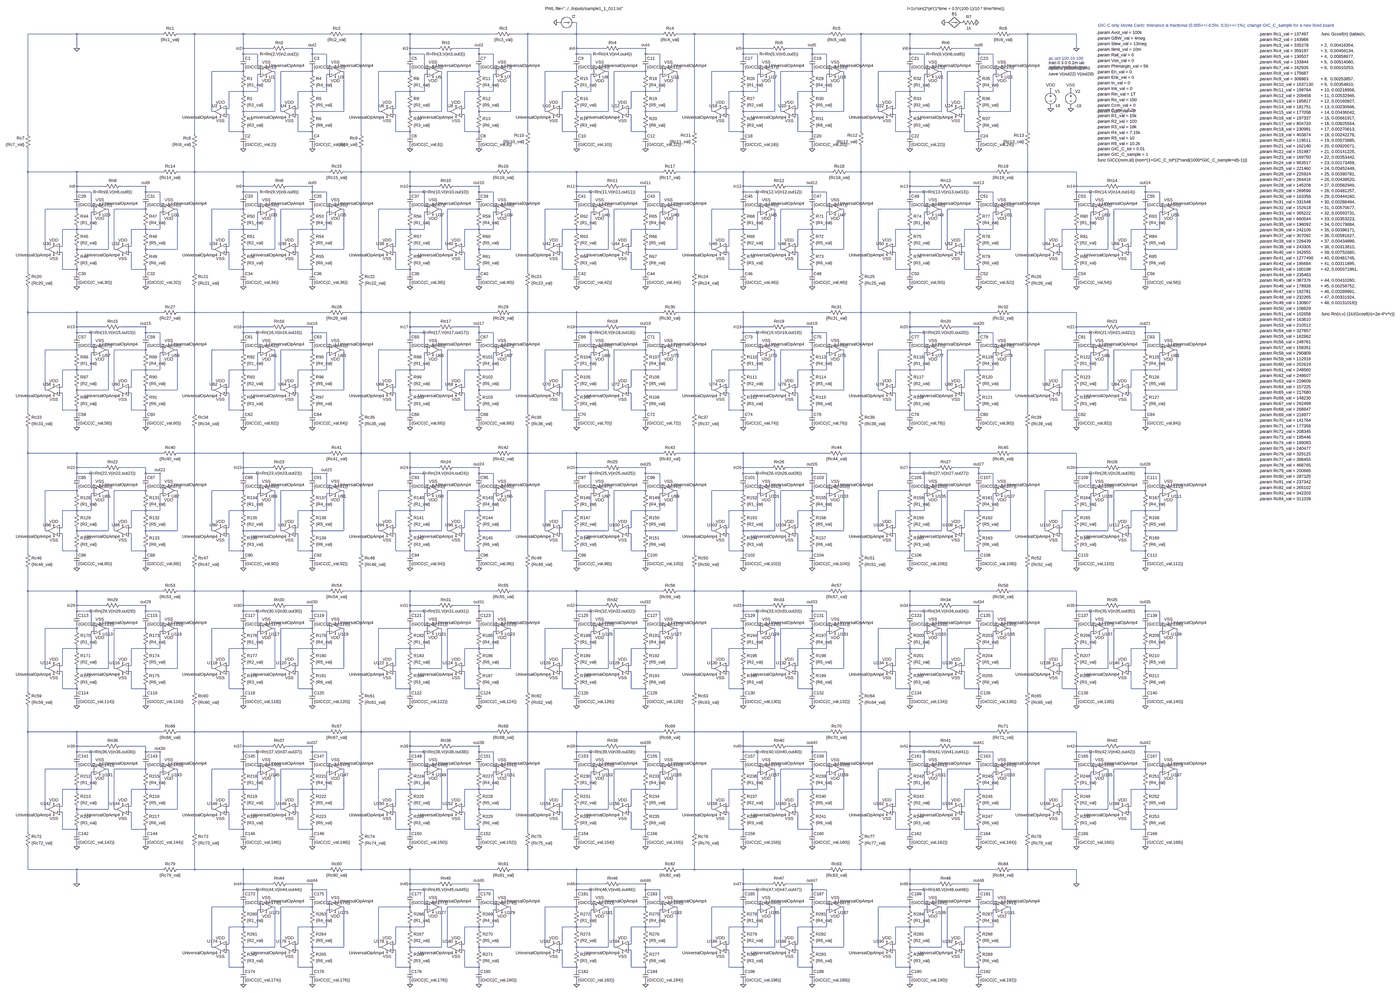
[diagram p0: schematic GIC_C.asc, whole sheet]
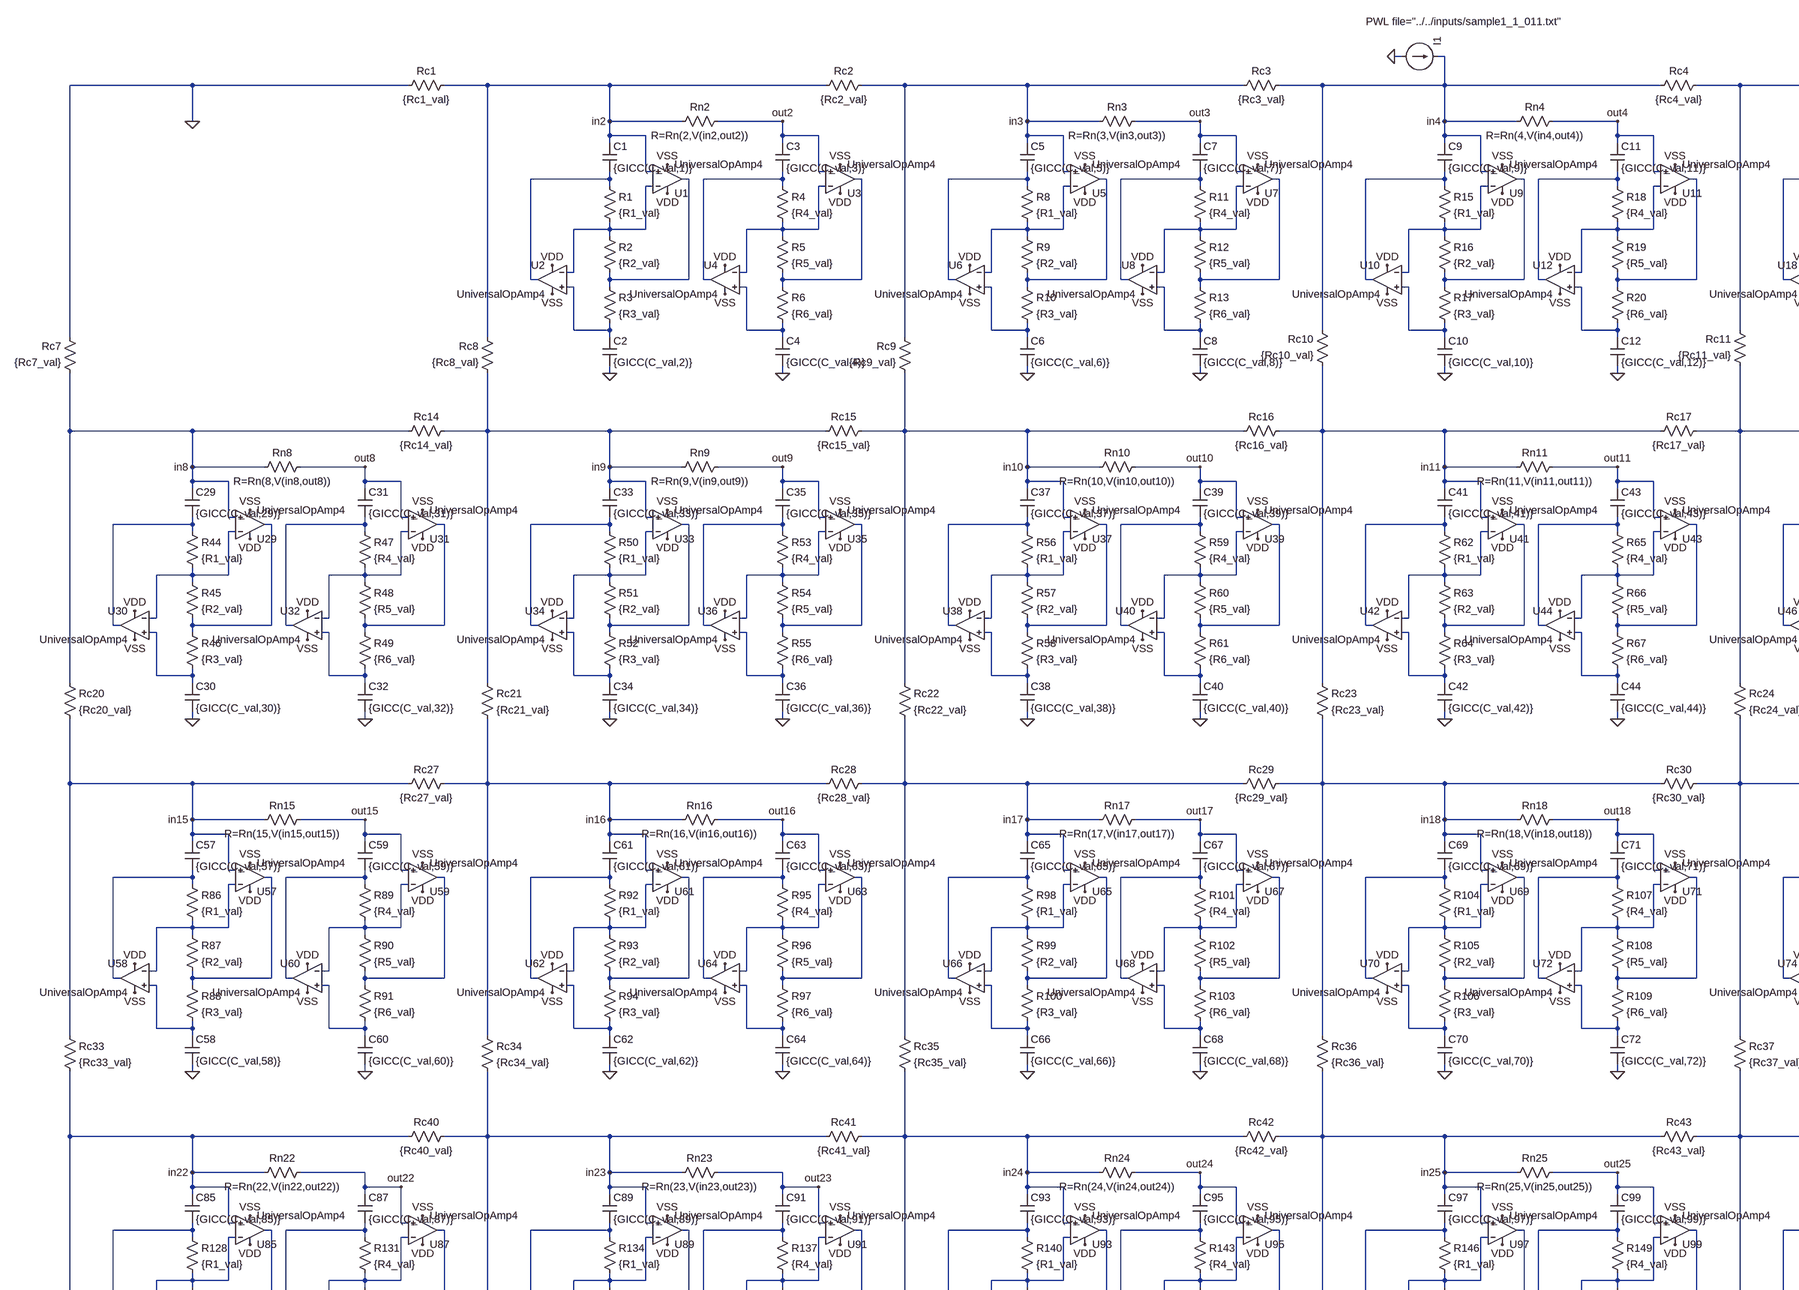
[diagram p1: schematic GIC_C.asc, part, row 1 of 2, column 1 of 2]
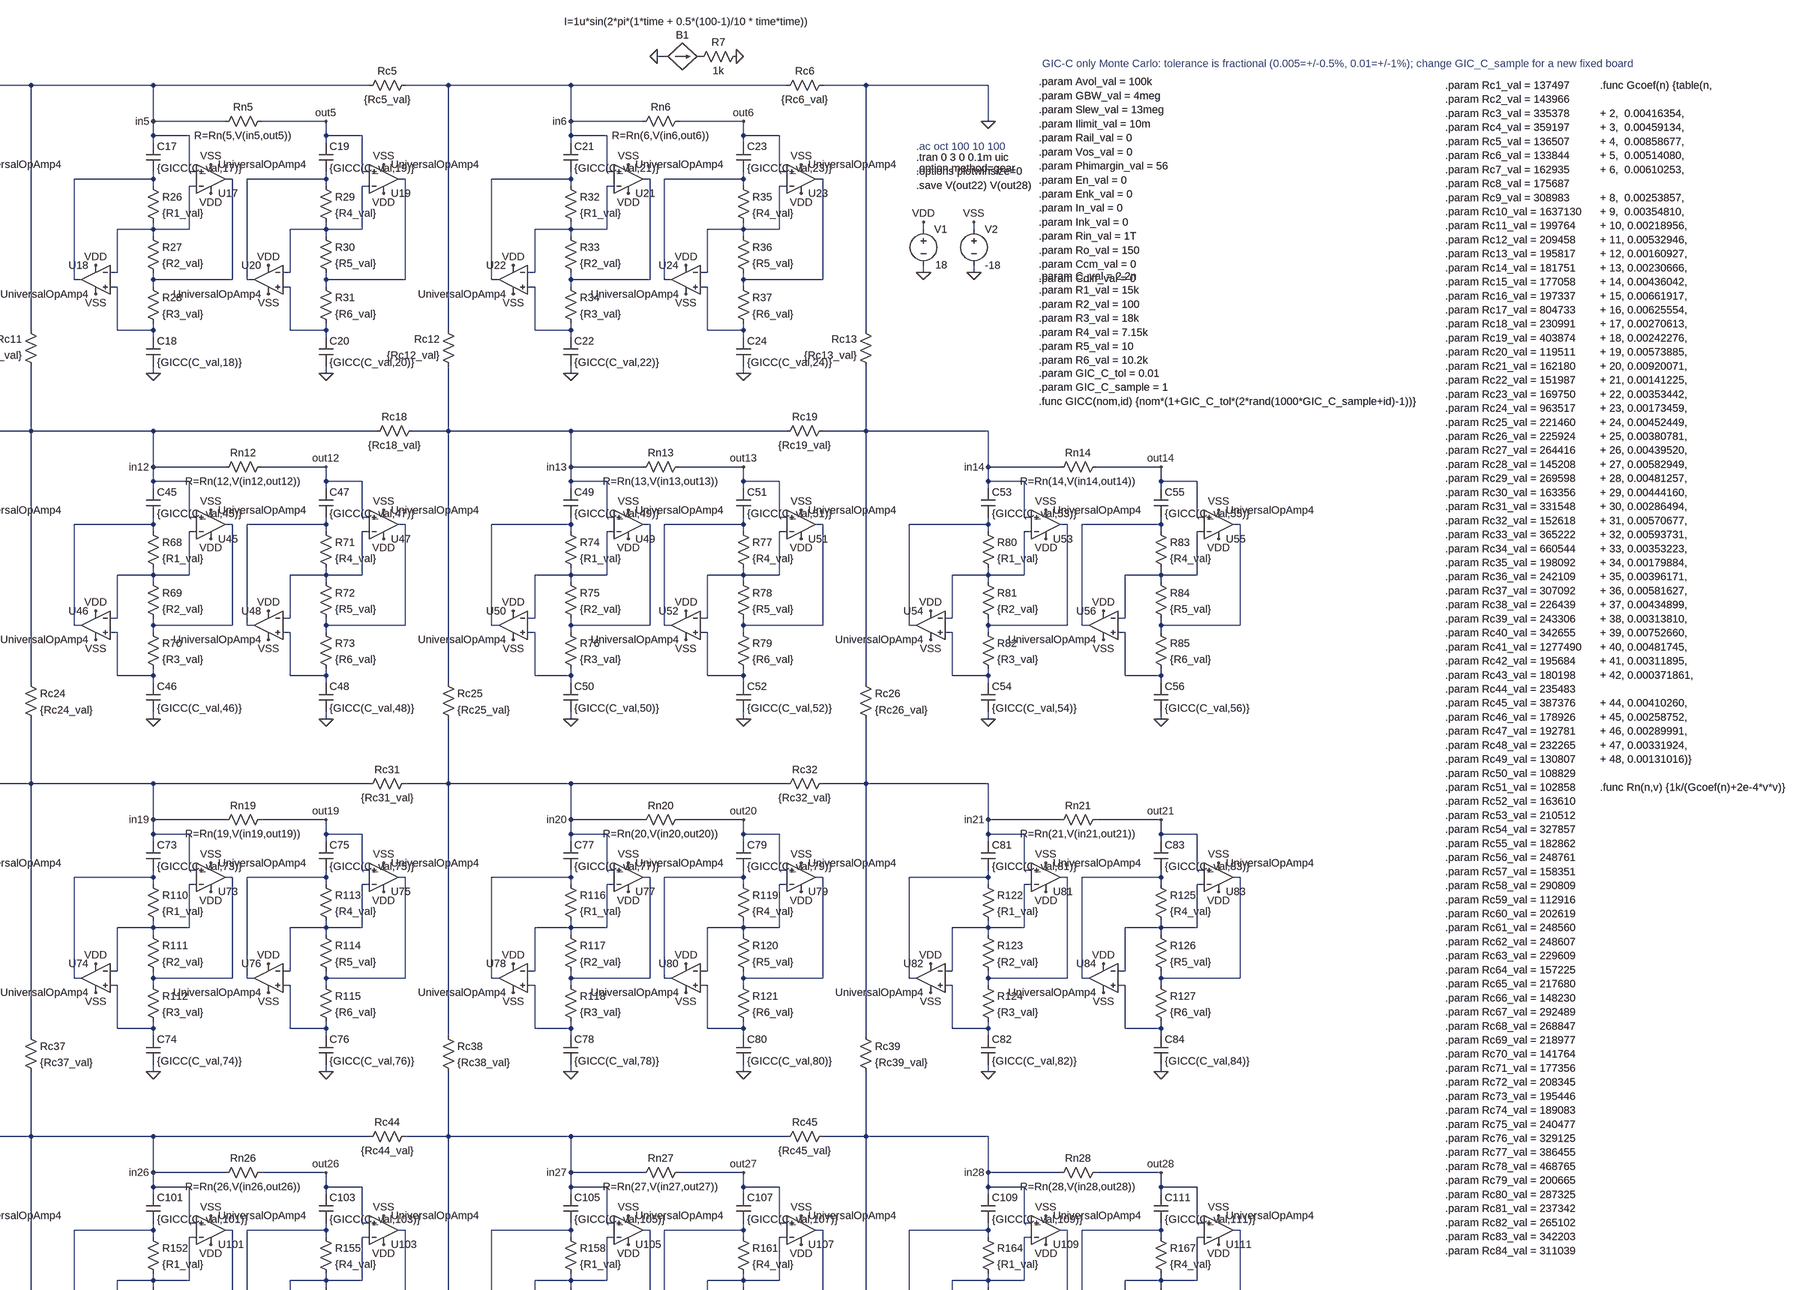
[diagram p2: schematic GIC_C.asc, part, row 1 of 2, column 2 of 2]
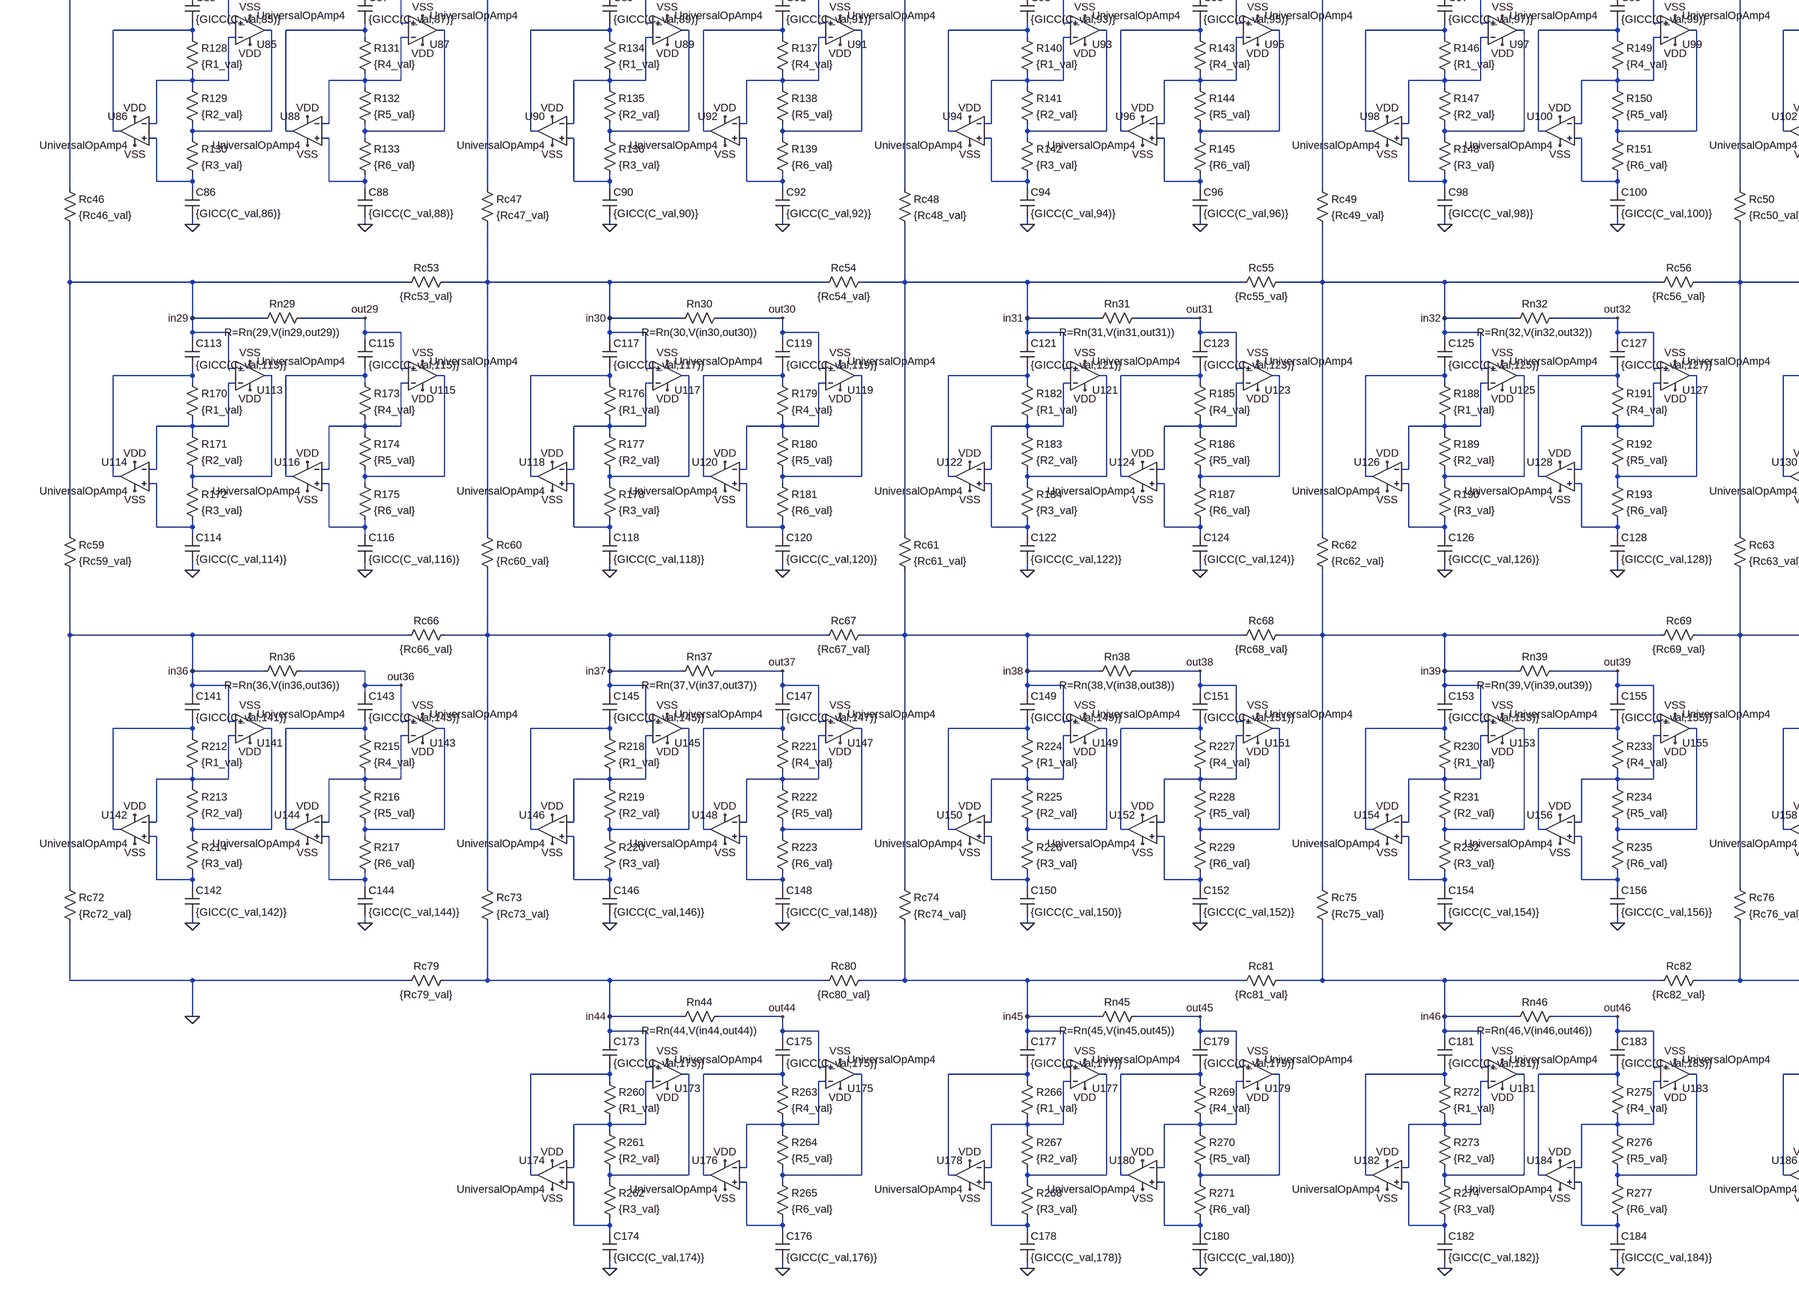
[diagram p3: schematic GIC_C.asc, part, row 2 of 2, column 1 of 2]
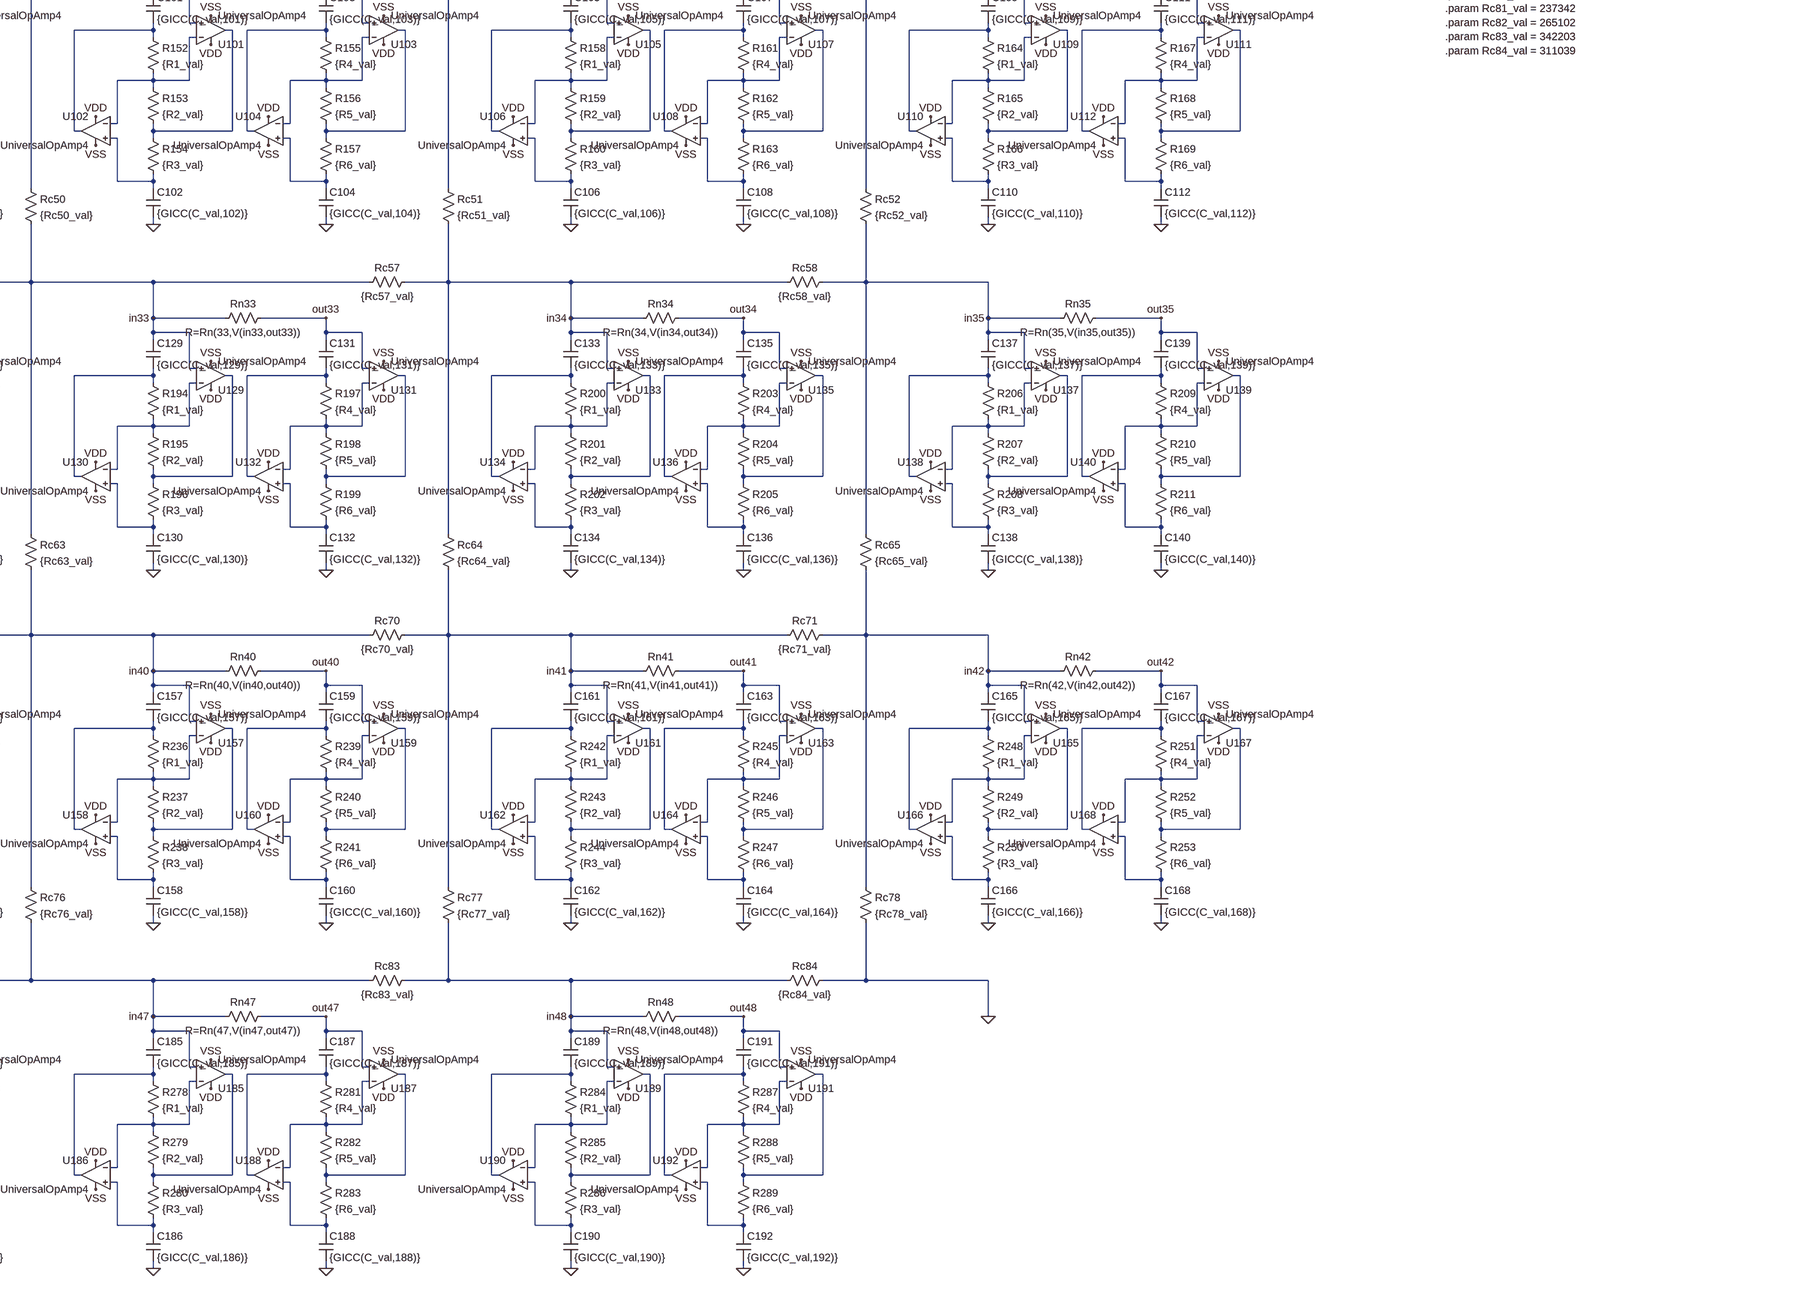
[diagram p4: schematic GIC_C.asc, part, row 2 of 2, column 2 of 2]
* GIC_C.asc
V1 VDD 0 18
V2 VSS 0 -18
C1 in2 N001 {GICC(C_val,1)}
R1 N001 N021 {R1_val}
R2 N021 N002 {R2_val}
R3 N002 N031 {R3_val}
C2 N031 0 {GICC(C_val,2)}
C3 out2 N003 {GICC(C_val,3)}
R4 N003 N022 {R4_val}
R5 N022 N004 {R5_val}
R6 N004 N032 {R6_val}
C4 N032 0 {GICC(C_val,4)}
Rn2 out2 in2 R=Rn(2,V(in2,out2))
C5 in3 N005 {GICC(C_val,5)}
R8 N005 N023 {R1_val}
R9 N023 N006 {R2_val}
R10 N006 N033 {R3_val}
C6 N033 0 {GICC(C_val,6)}
C7 out3 N007 {GICC(C_val,7)}
R11 N007 N024 {R4_val}
R12 N024 N008 {R5_val}
R13 N008 N034 {R6_val}
C8 N034 0 {GICC(C_val,8)}
Rn3 out3 in3 R=Rn(3,V(in3,out3))
C9 in4 N009 {GICC(C_val,9)}
R15 N009 N025 {R1_val}
R16 N025 N010 {R2_val}
R17 N010 N035 {R3_val}
C10 N035 0 {GICC(C_val,10)}
C11 out4 N011 {GICC(C_val,11)}
R18 N011 N026 {R4_val}
R19 N026 N012 {R5_val}
R20 N012 N036 {R6_val}
C12 N036 0 {GICC(C_val,12)}
Rn4 out4 in4 R=Rn(4,V(in4,out4))
Rc2 in3 in2 {Rc2_val}
Rc3 in4 in3 {Rc3_val}
Rc8 in9 in2 {Rc8_val}
Rc9 in10 in3 {Rc9_val}
Rc10 in11 in4 {Rc10_val}
Rc14 in8 in9 {Rc14_val}
Rc15 in9 in10 {Rc15_val}
Rc16 in10 in11 {Rc16_val}
Rc17 in11 in12 {Rc17_val}
Rc20 in8 in15 {Rc20_val}
Rc21 in9 in16 {Rc21_val}
Rc22 in10 in17 {Rc22_val}
Rc23 in11 in18 {Rc23_val}
Rc24 in12 in19 {Rc24_val}
Rc27 in16 in15 {Rc27_val}
Rc28 in17 in16 {Rc28_val}
Rc29 in18 in17 {Rc29_val}
Rc30 in19 in18 {Rc30_val}
Rc33 in15 in22 {Rc33_val}
Rc34 in16 in23 {Rc34_val}
Rc35 in17 in24 {Rc35_val}
Rc36 in18 in25 {Rc36_val}
Rc37 in19 in26 {Rc37_val}
Rc40 in23 in22 {Rc40_val}
Rc41 in24 in23 {Rc41_val}
Rc42 in25 in24 {Rc42_val}
Rc43 in26 in25 {Rc43_val}
Rc46 in22 in29 {Rc46_val}
Rc47 in23 in30 {Rc47_val}
Rc48 in24 in31 {Rc48_val}
Rc49 in25 in32 {Rc49_val}
Rc50 in26 in33 {Rc50_val}
Rc1 in2 0 {Rc1_val}
Rc7 in8 0 {Rc7_val}
Rc11 in12 in5 {Rc11_val}
Rc4 in4 in5 {Rc4_val}
Rc53 in30 in29 {Rc53_val}
Rc54 in31 in30 {Rc54_val}
Rc55 in32 in31 {Rc55_val}
Rc56 in33 in32 {Rc56_val}
R7 0 P001 1k
B1 0 P001 I=1u*sin(2*pi*(1*time + 0.5*(100-1)/10 * time*time))
I1 0 in4 PWL file="../../inputs/sample1_1_011.txt"
* U1: UniversalOpAmp4 Avol={Avol_val} GBW={GBW_val} Slew={Slew_val} Ilimit={Ilimit_val} Rail={Rail_val} Vos={Vos_val} Phimargin={Phimargin_val} En={En_val} Enk={Enk_val} In={In_val} Ink={Ink_val} Rin={Rin_val} Ro={Ro_val} Ccm={Ccm_val} Cdiff={Cdiff_val} (symbol OpAmps\UniversalOpAmp4 not available, pins judged from their places): In+=in2 In-=N021 V+=VDD V-=VSS OUT=N002
* U2: UniversalOpAmp4 Avol={Avol_val} GBW={GBW_val} Slew={Slew_val} Ilimit={Ilimit_val} Rail={Rail_val} Vos={Vos_val} Phimargin={Phimargin_val} En={En_val} Enk={Enk_val} In={In_val} Ink={Ink_val} Rin={Rin_val} Ro={Ro_val} Ccm={Ccm_val} Cdiff={Cdiff_val} (symbol OpAmps\UniversalOpAmp4 not available, pins judged from their places): In+=N031 In-=N021 V+=VDD V-=VSS OUT=N001
* U3: UniversalOpAmp4 Avol={Avol_val} GBW={GBW_val} Slew={Slew_val} Ilimit={Ilimit_val} Rail={Rail_val} Vos={Vos_val} Phimargin={Phimargin_val} En={En_val} Enk={Enk_val} In={In_val} Ink={Ink_val} Rin={Rin_val} Ro={Ro_val} Ccm={Ccm_val} Cdiff={Cdiff_val} (symbol OpAmps\UniversalOpAmp4 not available, pins judged from their places): In+=out2 In-=N022 V+=VDD V-=VSS OUT=N004
* U4: UniversalOpAmp4 Avol={Avol_val} GBW={GBW_val} Slew={Slew_val} Ilimit={Ilimit_val} Rail={Rail_val} Vos={Vos_val} Phimargin={Phimargin_val} En={En_val} Enk={Enk_val} In={In_val} Ink={Ink_val} Rin={Rin_val} Ro={Ro_val} Ccm={Ccm_val} Cdiff={Cdiff_val} (symbol OpAmps\UniversalOpAmp4 not available, pins judged from their places): In+=N032 In-=N022 V+=VDD V-=VSS OUT=N003
* U5: UniversalOpAmp4 Avol={Avol_val} GBW={GBW_val} Slew={Slew_val} Ilimit={Ilimit_val} Rail={Rail_val} Vos={Vos_val} Phimargin={Phimargin_val} En={En_val} Enk={Enk_val} In={In_val} Ink={Ink_val} Rin={Rin_val} Ro={Ro_val} Ccm={Ccm_val} Cdiff={Cdiff_val} (symbol OpAmps\UniversalOpAmp4 not available, pins judged from their places): In+=in3 In-=N023 V+=VDD V-=VSS OUT=N006
* U6: UniversalOpAmp4 Avol={Avol_val} GBW={GBW_val} Slew={Slew_val} Ilimit={Ilimit_val} Rail={Rail_val} Vos={Vos_val} Phimargin={Phimargin_val} En={En_val} Enk={Enk_val} In={In_val} Ink={Ink_val} Rin={Rin_val} Ro={Ro_val} Ccm={Ccm_val} Cdiff={Cdiff_val} (symbol OpAmps\UniversalOpAmp4 not available, pins judged from their places): In+=N033 In-=N023 V+=VDD V-=VSS OUT=N005
* U7: UniversalOpAmp4 Avol={Avol_val} GBW={GBW_val} Slew={Slew_val} Ilimit={Ilimit_val} Rail={Rail_val} Vos={Vos_val} Phimargin={Phimargin_val} En={En_val} Enk={Enk_val} In={In_val} Ink={Ink_val} Rin={Rin_val} Ro={Ro_val} Ccm={Ccm_val} Cdiff={Cdiff_val} (symbol OpAmps\UniversalOpAmp4 not available, pins judged from their places): In+=out3 In-=N024 V+=VDD V-=VSS OUT=N008
* U8: UniversalOpAmp4 Avol={Avol_val} GBW={GBW_val} Slew={Slew_val} Ilimit={Ilimit_val} Rail={Rail_val} Vos={Vos_val} Phimargin={Phimargin_val} En={En_val} Enk={Enk_val} In={In_val} Ink={Ink_val} Rin={Rin_val} Ro={Ro_val} Ccm={Ccm_val} Cdiff={Cdiff_val} (symbol OpAmps\UniversalOpAmp4 not available, pins judged from their places): In+=N034 In-=N024 V+=VDD V-=VSS OUT=N007
* U9: UniversalOpAmp4 Avol={Avol_val} GBW={GBW_val} Slew={Slew_val} Ilimit={Ilimit_val} Rail={Rail_val} Vos={Vos_val} Phimargin={Phimargin_val} En={En_val} Enk={Enk_val} In={In_val} Ink={Ink_val} Rin={Rin_val} Ro={Ro_val} Ccm={Ccm_val} Cdiff={Cdiff_val} (symbol OpAmps\UniversalOpAmp4 not available, pins judged from their places): In+=in4 In-=N025 V+=VDD V-=VSS OUT=N010
* U10: UniversalOpAmp4 Avol={Avol_val} GBW={GBW_val} Slew={Slew_val} Ilimit={Ilimit_val} Rail={Rail_val} Vos={Vos_val} Phimargin={Phimargin_val} En={En_val} Enk={Enk_val} In={In_val} Ink={Ink_val} Rin={Rin_val} Ro={Ro_val} Ccm={Ccm_val} Cdiff={Cdiff_val} (symbol OpAmps\UniversalOpAmp4 not available, pins judged from their places): In+=N035 In-=N025 V+=VDD V-=VSS OUT=N009
* U11: UniversalOpAmp4 Avol={Avol_val} GBW={GBW_val} Slew={Slew_val} Ilimit={Ilimit_val} Rail={Rail_val} Vos={Vos_val} Phimargin={Phimargin_val} En={En_val} Enk={Enk_val} In={In_val} Ink={Ink_val} Rin={Rin_val} Ro={Ro_val} Ccm={Ccm_val} Cdiff={Cdiff_val} (symbol OpAmps\UniversalOpAmp4 not available, pins judged from their places): In+=out4 In-=N026 V+=VDD V-=VSS OUT=N012
* U12: UniversalOpAmp4 Avol={Avol_val} GBW={GBW_val} Slew={Slew_val} Ilimit={Ilimit_val} Rail={Rail_val} Vos={Vos_val} Phimargin={Phimargin_val} En={En_val} Enk={Enk_val} In={In_val} Ink={Ink_val} Rin={Rin_val} Ro={Ro_val} Ccm={Ccm_val} Cdiff={Cdiff_val} (symbol OpAmps\UniversalOpAmp4 not available, pins judged from their places): In+=N036 In-=N026 V+=VDD V-=VSS OUT=N011
Rc12 in13 in6 {Rc12_val}
Rc19 in13 in14 {Rc19_val}
Rc25 in13 in20 {Rc25_val}
Rc26 in14 in21 {Rc26_val}
Rc32 in21 in20 {Rc32_val}
Rc38 in20 in27 {Rc38_val}
Rc39 in21 in28 {Rc39_val}
Rc45 in28 in27 {Rc45_val}
Rc51 in27 in34 {Rc51_val}
Rc52 in28 in35 {Rc52_val}
Rc13 in14 0 {Rc13_val}
Rc6 in6 0 {Rc6_val}
Rc58 in35 in34 {Rc58_val}
Rc5 in5 in6 {Rc5_val}
Rc18 in12 in13 {Rc18_val}
Rc31 in19 in20 {Rc31_val}
Rc44 in26 in27 {Rc44_val}
Rc57 in33 in34 {Rc57_val}
Rc59 in29 in36 {Rc59_val}
Rc60 in30 in37 {Rc60_val}
Rc61 in31 in38 {Rc61_val}
Rc62 in32 in39 {Rc62_val}
Rc63 in33 in40 {Rc63_val}
Rc66 in37 in36 {Rc66_val}
Rc67 in38 in37 {Rc67_val}
Rc68 in39 in38 {Rc68_val}
Rc69 in40 in39 {Rc69_val}
Rc72 in36 0 {Rc72_val}
Rc73 in37 in44 {Rc73_val}
Rc74 in38 in45 {Rc74_val}
Rc75 in39 in46 {Rc75_val}
Rc76 in40 in47 {Rc76_val}
Rc79 in44 0 {Rc79_val}
Rc80 in45 in44 {Rc80_val}
Rc81 in46 in45 {Rc81_val}
Rc82 in47 in46 {Rc82_val}
Rc64 in34 in41 {Rc64_val}
Rc65 in35 in42 {Rc65_val}
Rc71 in42 in41 {Rc71_val}
Rc77 in41 in48 {Rc77_val}
Rc78 in42 0 {Rc78_val}
Rc84 0 in48 {Rc84_val}
Rc70 in40 in41 {Rc70_val}
Rc83 in47 in48 {Rc83_val}
C17 in5 N013 {GICC(C_val,17)}
R26 N013 N027 {R1_val}
R27 N027 N014 {R2_val}
R28 N014 N037 {R3_val}
C18 N037 0 {GICC(C_val,18)}
C19 out5 N015 {GICC(C_val,19)}
R29 N015 N028 {R4_val}
R30 N028 N016 {R5_val}
R31 N016 N038 {R6_val}
C20 N038 0 {GICC(C_val,20)}
Rn5 out5 in5 R=Rn(5,V(in5,out5))
* U17: UniversalOpAmp4 Avol={Avol_val} GBW={GBW_val} Slew={Slew_val} Ilimit={Ilimit_val} Rail={Rail_val} Vos={Vos_val} Phimargin={Phimargin_val} En={En_val} Enk={Enk_val} In={In_val} Ink={Ink_val} Rin={Rin_val} Ro={Ro_val} Ccm={Ccm_val} Cdiff={Cdiff_val} (symbol OpAmps\UniversalOpAmp4 not available, pins judged from their places): In+=in5 In-=N027 V+=VDD V-=VSS OUT=N014
* U18: UniversalOpAmp4 Avol={Avol_val} GBW={GBW_val} Slew={Slew_val} Ilimit={Ilimit_val} Rail={Rail_val} Vos={Vos_val} Phimargin={Phimargin_val} En={En_val} Enk={Enk_val} In={In_val} Ink={Ink_val} Rin={Rin_val} Ro={Ro_val} Ccm={Ccm_val} Cdiff={Cdiff_val} (symbol OpAmps\UniversalOpAmp4 not available, pins judged from their places): In+=N037 In-=N027 V+=VDD V-=VSS OUT=N013
* U19: UniversalOpAmp4 Avol={Avol_val} GBW={GBW_val} Slew={Slew_val} Ilimit={Ilimit_val} Rail={Rail_val} Vos={Vos_val} Phimargin={Phimargin_val} En={En_val} Enk={Enk_val} In={In_val} Ink={Ink_val} Rin={Rin_val} Ro={Ro_val} Ccm={Ccm_val} Cdiff={Cdiff_val} (symbol OpAmps\UniversalOpAmp4 not available, pins judged from their places): In+=out5 In-=N028 V+=VDD V-=VSS OUT=N016
* U20: UniversalOpAmp4 Avol={Avol_val} GBW={GBW_val} Slew={Slew_val} Ilimit={Ilimit_val} Rail={Rail_val} Vos={Vos_val} Phimargin={Phimargin_val} En={En_val} Enk={Enk_val} In={In_val} Ink={Ink_val} Rin={Rin_val} Ro={Ro_val} Ccm={Ccm_val} Cdiff={Cdiff_val} (symbol OpAmps\UniversalOpAmp4 not available, pins judged from their places): In+=N038 In-=N028 V+=VDD V-=VSS OUT=N015
C21 in6 N017 {GICC(C_val,21)}
R32 N017 N029 {R1_val}
R33 N029 N018 {R2_val}
R34 N018 N039 {R3_val}
C22 N039 0 {GICC(C_val,22)}
C23 out6 N019 {GICC(C_val,23)}
R35 N019 N030 {R4_val}
R36 N030 N020 {R5_val}
R37 N020 N040 {R6_val}
C24 N040 0 {GICC(C_val,24)}
Rn6 out6 in6 R=Rn(6,V(in6,out6))
* U21: UniversalOpAmp4 Avol={Avol_val} GBW={GBW_val} Slew={Slew_val} Ilimit={Ilimit_val} Rail={Rail_val} Vos={Vos_val} Phimargin={Phimargin_val} En={En_val} Enk={Enk_val} In={In_val} Ink={Ink_val} Rin={Rin_val} Ro={Ro_val} Ccm={Ccm_val} Cdiff={Cdiff_val} (symbol OpAmps\UniversalOpAmp4 not available, pins judged from their places): In+=in6 In-=N029 V+=VDD V-=VSS OUT=N018
* U22: UniversalOpAmp4 Avol={Avol_val} GBW={GBW_val} Slew={Slew_val} Ilimit={Ilimit_val} Rail={Rail_val} Vos={Vos_val} Phimargin={Phimargin_val} En={En_val} Enk={Enk_val} In={In_val} Ink={Ink_val} Rin={Rin_val} Ro={Ro_val} Ccm={Ccm_val} Cdiff={Cdiff_val} (symbol OpAmps\UniversalOpAmp4 not available, pins judged from their places): In+=N039 In-=N029 V+=VDD V-=VSS OUT=N017
* U23: UniversalOpAmp4 Avol={Avol_val} GBW={GBW_val} Slew={Slew_val} Ilimit={Ilimit_val} Rail={Rail_val} Vos={Vos_val} Phimargin={Phimargin_val} En={En_val} Enk={Enk_val} In={In_val} Ink={Ink_val} Rin={Rin_val} Ro={Ro_val} Ccm={Ccm_val} Cdiff={Cdiff_val} (symbol OpAmps\UniversalOpAmp4 not available, pins judged from their places): In+=out6 In-=N030 V+=VDD V-=VSS OUT=N020
* U24: UniversalOpAmp4 Avol={Avol_val} GBW={GBW_val} Slew={Slew_val} Ilimit={Ilimit_val} Rail={Rail_val} Vos={Vos_val} Phimargin={Phimargin_val} En={En_val} Enk={Enk_val} In={In_val} Ink={Ink_val} Rin={Rin_val} Ro={Ro_val} Ccm={Ccm_val} Cdiff={Cdiff_val} (symbol OpAmps\UniversalOpAmp4 not available, pins judged from their places): In+=N040 In-=N030 V+=VDD V-=VSS OUT=N019
C29 in8 N041 {GICC(C_val,29)}
R44 N041 N069 {R1_val}
R45 N069 N042 {R2_val}
R46 N042 N083 {R3_val}
C30 N083 0 {GICC(C_val,30)}
C31 out8 N043 {GICC(C_val,31)}
R47 N043 N070 {R4_val}
R48 N070 N044 {R5_val}
R49 N044 N084 {R6_val}
C32 N084 0 {GICC(C_val,32)}
Rn8 out8 in8 R=Rn(8,V(in8,out8))
* U29: UniversalOpAmp4 Avol={Avol_val} GBW={GBW_val} Slew={Slew_val} Ilimit={Ilimit_val} Rail={Rail_val} Vos={Vos_val} Phimargin={Phimargin_val} En={En_val} Enk={Enk_val} In={In_val} Ink={Ink_val} Rin={Rin_val} Ro={Ro_val} Ccm={Ccm_val} Cdiff={Cdiff_val} (symbol OpAmps\UniversalOpAmp4 not available, pins judged from their places): In+=in8 In-=N069 V+=VDD V-=VSS OUT=N042
* U30: UniversalOpAmp4 Avol={Avol_val} GBW={GBW_val} Slew={Slew_val} Ilimit={Ilimit_val} Rail={Rail_val} Vos={Vos_val} Phimargin={Phimargin_val} En={En_val} Enk={Enk_val} In={In_val} Ink={Ink_val} Rin={Rin_val} Ro={Ro_val} Ccm={Ccm_val} Cdiff={Cdiff_val} (symbol OpAmps\UniversalOpAmp4 not available, pins judged from their places): In+=N083 In-=N069 V+=VDD V-=VSS OUT=N041
* U31: UniversalOpAmp4 Avol={Avol_val} GBW={GBW_val} Slew={Slew_val} Ilimit={Ilimit_val} Rail={Rail_val} Vos={Vos_val} Phimargin={Phimargin_val} En={En_val} Enk={Enk_val} In={In_val} Ink={Ink_val} Rin={Rin_val} Ro={Ro_val} Ccm={Ccm_val} Cdiff={Cdiff_val} (symbol OpAmps\UniversalOpAmp4 not available, pins judged from their places): In+=out8 In-=N070 V+=VDD V-=VSS OUT=N044
* U32: UniversalOpAmp4 Avol={Avol_val} GBW={GBW_val} Slew={Slew_val} Ilimit={Ilimit_val} Rail={Rail_val} Vos={Vos_val} Phimargin={Phimargin_val} En={En_val} Enk={Enk_val} In={In_val} Ink={Ink_val} Rin={Rin_val} Ro={Ro_val} Ccm={Ccm_val} Cdiff={Cdiff_val} (symbol OpAmps\UniversalOpAmp4 not available, pins judged from their places): In+=N084 In-=N070 V+=VDD V-=VSS OUT=N043
C33 in9 N045 {GICC(C_val,33)}
R50 N045 N071 {R1_val}
R51 N071 N046 {R2_val}
R52 N046 N085 {R3_val}
C34 N085 0 {GICC(C_val,34)}
C35 out9 N047 {GICC(C_val,35)}
R53 N047 N072 {R4_val}
R54 N072 N048 {R5_val}
R55 N048 N086 {R6_val}
C36 N086 0 {GICC(C_val,36)}
Rn9 out9 in9 R=Rn(9,V(in9,out9))
* U33: UniversalOpAmp4 Avol={Avol_val} GBW={GBW_val} Slew={Slew_val} Ilimit={Ilimit_val} Rail={Rail_val} Vos={Vos_val} Phimargin={Phimargin_val} En={En_val} Enk={Enk_val} In={In_val} Ink={Ink_val} Rin={Rin_val} Ro={Ro_val} Ccm={Ccm_val} Cdiff={Cdiff_val} (symbol OpAmps\UniversalOpAmp4 not available, pins judged from their places): In+=in9 In-=N071 V+=VDD V-=VSS OUT=N046
* U34: UniversalOpAmp4 Avol={Avol_val} GBW={GBW_val} Slew={Slew_val} Ilimit={Ilimit_val} Rail={Rail_val} Vos={Vos_val} Phimargin={Phimargin_val} En={En_val} Enk={Enk_val} In={In_val} Ink={Ink_val} Rin={Rin_val} Ro={Ro_val} Ccm={Ccm_val} Cdiff={Cdiff_val} (symbol OpAmps\UniversalOpAmp4 not available, pins judged from their places): In+=N085 In-=N071 V+=VDD V-=VSS OUT=N045
* U35: UniversalOpAmp4 Avol={Avol_val} GBW={GBW_val} Slew={Slew_val} Ilimit={Ilimit_val} Rail={Rail_val} Vos={Vos_val} Phimargin={Phimargin_val} En={En_val} Enk={Enk_val} In={In_val} Ink={Ink_val} Rin={Rin_val} Ro={Ro_val} Ccm={Ccm_val} Cdiff={Cdiff_val} (symbol OpAmps\UniversalOpAmp4 not available, pins judged from their places): In+=out9 In-=N072 V+=VDD V-=VSS OUT=N048
* U36: UniversalOpAmp4 Avol={Avol_val} GBW={GBW_val} Slew={Slew_val} Ilimit={Ilimit_val} Rail={Rail_val} Vos={Vos_val} Phimargin={Phimargin_val} En={En_val} Enk={Enk_val} In={In_val} Ink={Ink_val} Rin={Rin_val} Ro={Ro_val} Ccm={Ccm_val} Cdiff={Cdiff_val} (symbol OpAmps\UniversalOpAmp4 not available, pins judged from their places): In+=N086 In-=N072 V+=VDD V-=VSS OUT=N047
C37 in10 N049 {GICC(C_val,37)}
R56 N049 N073 {R1_val}
R57 N073 N050 {R2_val}
R58 N050 N087 {R3_val}
C38 N087 0 {GICC(C_val,38)}
C39 out10 N051 {GICC(C_val,39)}
R59 N051 N074 {R4_val}
R60 N074 N052 {R5_val}
R61 N052 N088 {R6_val}
C40 N088 0 {GICC(C_val,40)}
Rn10 out10 in10 R=Rn(10,V(in10,out10))
* U37: UniversalOpAmp4 Avol={Avol_val} GBW={GBW_val} Slew={Slew_val} Ilimit={Ilimit_val} Rail={Rail_val} Vos={Vos_val} Phimargin={Phimargin_val} En={En_val} Enk={Enk_val} In={In_val} Ink={Ink_val} Rin={Rin_val} Ro={Ro_val} Ccm={Ccm_val} Cdiff={Cdiff_val} (symbol OpAmps\UniversalOpAmp4 not available, pins judged from their places): In+=in10 In-=N073 V+=VDD V-=VSS OUT=N050
* U38: UniversalOpAmp4 Avol={Avol_val} GBW={GBW_val} Slew={Slew_val} Ilimit={Ilimit_val} Rail={Rail_val} Vos={Vos_val} Phimargin={Phimargin_val} En={En_val} Enk={Enk_val} In={In_val} Ink={Ink_val} Rin={Rin_val} Ro={Ro_val} Ccm={Ccm_val} Cdiff={Cdiff_val} (symbol OpAmps\UniversalOpAmp4 not available, pins judged from their places): In+=N087 In-=N073 V+=VDD V-=VSS OUT=N049
* U39: UniversalOpAmp4 Avol={Avol_val} GBW={GBW_val} Slew={Slew_val} Ilimit={Ilimit_val} Rail={Rail_val} Vos={Vos_val} Phimargin={Phimargin_val} En={En_val} Enk={Enk_val} In={In_val} Ink={Ink_val} Rin={Rin_val} Ro={Ro_val} Ccm={Ccm_val} Cdiff={Cdiff_val} (symbol OpAmps\UniversalOpAmp4 not available, pins judged from their places): In+=out10 In-=N074 V+=VDD V-=VSS OUT=N052
* U40: UniversalOpAmp4 Avol={Avol_val} GBW={GBW_val} Slew={Slew_val} Ilimit={Ilimit_val} Rail={Rail_val} Vos={Vos_val} Phimargin={Phimargin_val} En={En_val} Enk={Enk_val} In={In_val} Ink={Ink_val} Rin={Rin_val} Ro={Ro_val} Ccm={Ccm_val} Cdiff={Cdiff_val} (symbol OpAmps\UniversalOpAmp4 not available, pins judged from their places): In+=N088 In-=N074 V+=VDD V-=VSS OUT=N051
C41 in11 N053 {GICC(C_val,41)}
R62 N053 N075 {R1_val}
R63 N075 N054 {R2_val}
R64 N054 N089 {R3_val}
C42 N089 0 {GICC(C_val,42)}
C43 out11 N055 {GICC(C_val,43)}
R65 N055 N076 {R4_val}
R66 N076 N056 {R5_val}
R67 N056 N090 {R6_val}
C44 N090 0 {GICC(C_val,44)}
Rn11 out11 in11 R=Rn(11,V(in11,out11))
* U41: UniversalOpAmp4 Avol={Avol_val} GBW={GBW_val} Slew={Slew_val} Ilimit={Ilimit_val} Rail={Rail_val} Vos={Vos_val} Phimargin={Phimargin_val} En={En_val} Enk={Enk_val} In={In_val} Ink={Ink_val} Rin={Rin_val} Ro={Ro_val} Ccm={Ccm_val} Cdiff={Cdiff_val} (symbol OpAmps\UniversalOpAmp4 not available, pins judged from their places): In+=in11 In-=N075 V+=VDD V-=VSS OUT=N054
* U42: UniversalOpAmp4 Avol={Avol_val} GBW={GBW_val} Slew={Slew_val} Ilimit={Ilimit_val} Rail={Rail_val} Vos={Vos_val} Phimargin={Phimargin_val} En={En_val} Enk={Enk_val} In={In_val} Ink={Ink_val} Rin={Rin_val} Ro={Ro_val} Ccm={Ccm_val} Cdiff={Cdiff_val} (symbol OpAmps\UniversalOpAmp4 not available, pins judged from their places): In+=N089 In-=N075 V+=VDD V-=VSS OUT=N053
* U43: UniversalOpAmp4 Avol={Avol_val} GBW={GBW_val} Slew={Slew_val} Ilimit={Ilimit_val} Rail={Rail_val} Vos={Vos_val} Phimargin={Phimargin_val} En={En_val} Enk={Enk_val} In={In_val} Ink={Ink_val} Rin={Rin_val} Ro={Ro_val} Ccm={Ccm_val} Cdiff={Cdiff_val} (symbol OpAmps\UniversalOpAmp4 not available, pins judged from their places): In+=out11 In-=N076 V+=VDD V-=VSS OUT=N056
* U44: UniversalOpAmp4 Avol={Avol_val} GBW={GBW_val} Slew={Slew_val} Ilimit={Ilimit_val} Rail={Rail_val} Vos={Vos_val} Phimargin={Phimargin_val} En={En_val} Enk={Enk_val} In={In_val} Ink={Ink_val} Rin={Rin_val} Ro={Ro_val} Ccm={Ccm_val} Cdiff={Cdiff_val} (symbol OpAmps\UniversalOpAmp4 not available, pins judged from their places): In+=N090 In-=N076 V+=VDD V-=VSS OUT=N055
C45 in12 N057 {GICC(C_val,45)}
R68 N057 N077 {R1_val}
R69 N077 N058 {R2_val}
R70 N058 N091 {R3_val}
C46 N091 0 {GICC(C_val,46)}
C47 out12 N059 {GICC(C_val,47)}
R71 N059 N078 {R4_val}
R72 N078 N060 {R5_val}
R73 N060 N092 {R6_val}
C48 N092 0 {GICC(C_val,48)}
Rn12 out12 in12 R=Rn(12,V(in12,out12))
* U45: UniversalOpAmp4 Avol={Avol_val} GBW={GBW_val} Slew={Slew_val} Ilimit={Ilimit_val} Rail={Rail_val} Vos={Vos_val} Phimargin={Phimargin_val} En={En_val} Enk={Enk_val} In={In_val} Ink={Ink_val} Rin={Rin_val} Ro={Ro_val} Ccm={Ccm_val} Cdiff={Cdiff_val} (symbol OpAmps\UniversalOpAmp4 not available, pins judged from their places): In+=in12 In-=N077 V+=VDD V-=VSS OUT=N058
* U46: UniversalOpAmp4 Avol={Avol_val} GBW={GBW_val} Slew={Slew_val} Ilimit={Ilimit_val} Rail={Rail_val} Vos={Vos_val} Phimargin={Phimargin_val} En={En_val} Enk={Enk_val} In={In_val} Ink={Ink_val} Rin={Rin_val} Ro={Ro_val} Ccm={Ccm_val} Cdiff={Cdiff_val} (symbol OpAmps\UniversalOpAmp4 not available, pins judged from their places): In+=N091 In-=N077 V+=VDD V-=VSS OUT=N057
* U47: UniversalOpAmp4 Avol={Avol_val} GBW={GBW_val} Slew={Slew_val} Ilimit={Ilimit_val} Rail={Rail_val} Vos={Vos_val} Phimargin={Phimargin_val} En={En_val} Enk={Enk_val} In={In_val} Ink={Ink_val} Rin={Rin_val} Ro={Ro_val} Ccm={Ccm_val} Cdiff={Cdiff_val} (symbol OpAmps\UniversalOpAmp4 not available, pins judged from their places): In+=out12 In-=N078 V+=VDD V-=VSS OUT=N060
* U48: UniversalOpAmp4 Avol={Avol_val} GBW={GBW_val} Slew={Slew_val} Ilimit={Ilimit_val} Rail={Rail_val} Vos={Vos_val} Phimargin={Phimargin_val} En={En_val} Enk={Enk_val} In={In_val} Ink={Ink_val} Rin={Rin_val} Ro={Ro_val} Ccm={Ccm_val} Cdiff={Cdiff_val} (symbol OpAmps\UniversalOpAmp4 not available, pins judged from their places): In+=N092 In-=N078 V+=VDD V-=VSS OUT=N059
C49 in13 N061 {GICC(C_val,49)}
R74 N061 N079 {R1_val}
R75 N079 N062 {R2_val}
R76 N062 N093 {R3_val}
C50 N093 0 {GICC(C_val,50)}
C51 out13 N063 {GICC(C_val,51)}
R77 N063 N080 {R4_val}
R78 N080 N064 {R5_val}
R79 N064 N094 {R6_val}
C52 N094 0 {GICC(C_val,52)}
Rn13 out13 in13 R=Rn(13,V(in13,out13))
* U49: UniversalOpAmp4 Avol={Avol_val} GBW={GBW_val} Slew={Slew_val} Ilimit={Ilimit_val} Rail={Rail_val} Vos={Vos_val} Phimargin={Phimargin_val} En={En_val} Enk={Enk_val} In={In_val} Ink={Ink_val} Rin={Rin_val} Ro={Ro_val} Ccm={Ccm_val} Cdiff={Cdiff_val} (symbol OpAmps\UniversalOpAmp4 not available, pins judged from their places): In+=in13 In-=N079 V+=VDD V-=VSS OUT=N062
* U50: UniversalOpAmp4 Avol={Avol_val} GBW={GBW_val} Slew={Slew_val} Ilimit={Ilimit_val} Rail={Rail_val} Vos={Vos_val} Phimargin={Phimargin_val} En={En_val} Enk={Enk_val} In={In_val} Ink={Ink_val} Rin={Rin_val} Ro={Ro_val} Ccm={Ccm_val} Cdiff={Cdiff_val} (symbol OpAmps\UniversalOpAmp4 not available, pins judged from their places): In+=N093 In-=N079 V+=VDD V-=VSS OUT=N061
* U51: UniversalOpAmp4 Avol={Avol_val} GBW={GBW_val} Slew={Slew_val} Ilimit={Ilimit_val} Rail={Rail_val} Vos={Vos_val} Phimargin={Phimargin_val} En={En_val} Enk={Enk_val} In={In_val} Ink={Ink_val} Rin={Rin_val} Ro={Ro_val} Ccm={Ccm_val} Cdiff={Cdiff_val} (symbol OpAmps\UniversalOpAmp4 not available, pins judged from their places): In+=out13 In-=N080 V+=VDD V-=VSS OUT=N064
* U52: UniversalOpAmp4 Avol={Avol_val} GBW={GBW_val} Slew={Slew_val} Ilimit={Ilimit_val} Rail={Rail_val} Vos={Vos_val} Phimargin={Phimargin_val} En={En_val} Enk={Enk_val} In={In_val} Ink={Ink_val} Rin={Rin_val} Ro={Ro_val} Ccm={Ccm_val} Cdiff={Cdiff_val} (symbol OpAmps\UniversalOpAmp4 not available, pins judged from their places): In+=N094 In-=N080 V+=VDD V-=VSS OUT=N063
C53 in14 N065 {GICC(C_val,53)}
R80 N065 N081 {R1_val}
R81 N081 N066 {R2_val}
R82 N066 N095 {R3_val}
C54 N095 0 {GICC(C_val,54)}
C55 out14 N067 {GICC(C_val,55)}
R83 N067 N082 {R4_val}
R84 N082 N068 {R5_val}
R85 N068 N096 {R6_val}
C56 N096 0 {GICC(C_val,56)}
Rn14 out14 in14 R=Rn(14,V(in14,out14))
* U53: UniversalOpAmp4 Avol={Avol_val} GBW={GBW_val} Slew={Slew_val} Ilimit={Ilimit_val} Rail={Rail_val} Vos={Vos_val} Phimargin={Phimargin_val} En={En_val} Enk={Enk_val} In={In_val} Ink={Ink_val} Rin={Rin_val} Ro={Ro_val} Ccm={Ccm_val} Cdiff={Cdiff_val} (symbol OpAmps\UniversalOpAmp4 not available, pins judged from their places): In+=in14 In-=N081 V+=VDD V-=VSS OUT=N066
* U54: UniversalOpAmp4 Avol={Avol_val} GBW={GBW_val} Slew={Slew_val} Ilimit={Ilimit_val} Rail={Rail_val} Vos={Vos_val} Phimargin={Phimargin_val} En={En_val} Enk={Enk_val} In={In_val} Ink={Ink_val} Rin={Rin_val} Ro={Ro_val} Ccm={Ccm_val} Cdiff={Cdiff_val} (symbol OpAmps\UniversalOpAmp4 not available, pins judged from their places): In+=N095 In-=N081 V+=VDD V-=VSS OUT=N065
* U55: UniversalOpAmp4 Avol={Avol_val} GBW={GBW_val} Slew={Slew_val} Ilimit={Ilimit_val} Rail={Rail_val} Vos={Vos_val} Phimargin={Phimargin_val} En={En_val} Enk={Enk_val} In={In_val} Ink={Ink_val} Rin={Rin_val} Ro={Ro_val} Ccm={Ccm_val} Cdiff={Cdiff_val} (symbol OpAmps\UniversalOpAmp4 not available, pins judged from their places): In+=out14 In-=N082 V+=VDD V-=VSS OUT=N068
* U56: UniversalOpAmp4 Avol={Avol_val} GBW={GBW_val} Slew={Slew_val} Ilimit={Ilimit_val} Rail={Rail_val} Vos={Vos_val} Phimargin={Phimargin_val} En={En_val} Enk={Enk_val} In={In_val} Ink={Ink_val} Rin={Rin_val} Ro={Ro_val} Ccm={Ccm_val} Cdiff={Cdiff_val} (symbol OpAmps\UniversalOpAmp4 not available, pins judged from their places): In+=N096 In-=N082 V+=VDD V-=VSS OUT=N067
C57 in15 N097 {GICC(C_val,57)}
R86 N097 N125 {R1_val}
R87 N125 N098 {R2_val}
R88 N098 N139 {R3_val}
C58 N139 0 {GICC(C_val,58)}
C59 out15 N099 {GICC(C_val,59)}
R89 N099 N126 {R4_val}
R90 N126 N100 {R5_val}
R91 N100 N140 {R6_val}
C60 N140 0 {GICC(C_val,60)}
Rn15 out15 in15 R=Rn(15,V(in15,out15))
* U57: UniversalOpAmp4 Avol={Avol_val} GBW={GBW_val} Slew={Slew_val} Ilimit={Ilimit_val} Rail={Rail_val} Vos={Vos_val} Phimargin={Phimargin_val} En={En_val} Enk={Enk_val} In={In_val} Ink={Ink_val} Rin={Rin_val} Ro={Ro_val} Ccm={Ccm_val} Cdiff={Cdiff_val} (symbol OpAmps\UniversalOpAmp4 not available, pins judged from their places): In+=in15 In-=N125 V+=VDD V-=VSS OUT=N098
* U58: UniversalOpAmp4 Avol={Avol_val} GBW={GBW_val} Slew={Slew_val} Ilimit={Ilimit_val} Rail={Rail_val} Vos={Vos_val} Phimargin={Phimargin_val} En={En_val} Enk={Enk_val} In={In_val} Ink={Ink_val} Rin={Rin_val} Ro={Ro_val} Ccm={Ccm_val} Cdiff={Cdiff_val} (symbol OpAmps\UniversalOpAmp4 not available, pins judged from their places): In+=N139 In-=N125 V+=VDD V-=VSS OUT=N097
* U59: UniversalOpAmp4 Avol={Avol_val} GBW={GBW_val} Slew={Slew_val} Ilimit={Ilimit_val} Rail={Rail_val} Vos={Vos_val} Phimargin={Phimargin_val} En={En_val} Enk={Enk_val} In={In_val} Ink={Ink_val} Rin={Rin_val} Ro={Ro_val} Ccm={Ccm_val} Cdiff={Cdiff_val} (symbol OpAmps\UniversalOpAmp4 not available, pins judged from their places): In+=out15 In-=N126 V+=VDD V-=VSS OUT=N100
* U60: UniversalOpAmp4 Avol={Avol_val} GBW={GBW_val} Slew={Slew_val} Ilimit={Ilimit_val} Rail={Rail_val} Vos={Vos_val} Phimargin={Phimargin_val} En={En_val} Enk={Enk_val} In={In_val} Ink={Ink_val} Rin={Rin_val} Ro={Ro_val} Ccm={Ccm_val} Cdiff={Cdiff_val} (symbol OpAmps\UniversalOpAmp4 not available, pins judged from their places): In+=N140 In-=N126 V+=VDD V-=VSS OUT=N099
C61 in16 N101 {GICC(C_val,61)}
R92 N101 N127 {R1_val}
R93 N127 N102 {R2_val}
R94 N102 N141 {R3_val}
C62 N141 0 {GICC(C_val,62)}
C63 out16 N103 {GICC(C_val,63)}
R95 N103 N128 {R4_val}
R96 N128 N104 {R5_val}
R97 N104 N142 {R6_val}
C64 N142 0 {GICC(C_val,64)}
Rn16 out16 in16 R=Rn(16,V(in16,out16))
* U61: UniversalOpAmp4 Avol={Avol_val} GBW={GBW_val} Slew={Slew_val} Ilimit={Ilimit_val} Rail={Rail_val} Vos={Vos_val} Phimargin={Phimargin_val} En={En_val} Enk={Enk_val} In={In_val} Ink={Ink_val} Rin={Rin_val} Ro={Ro_val} Ccm={Ccm_val} Cdiff={Cdiff_val} (symbol OpAmps\UniversalOpAmp4 not available, pins judged from their places): In+=in16 In-=N127 V+=VDD V-=VSS OUT=N102
* U62: UniversalOpAmp4 Avol={Avol_val} GBW={GBW_val} Slew={Slew_val} Ilimit={Ilimit_val} Rail={Rail_val} Vos={Vos_val} Phimargin={Phimargin_val} En={En_val} Enk={Enk_val} In={In_val} Ink={Ink_val} Rin={Rin_val} Ro={Ro_val} Ccm={Ccm_val} Cdiff={Cdiff_val} (symbol OpAmps\UniversalOpAmp4 not available, pins judged from their places): In+=N141 In-=N127 V+=VDD V-=VSS OUT=N101
* U63: UniversalOpAmp4 Avol={Avol_val} GBW={GBW_val} Slew={Slew_val} Ilimit={Ilimit_val} Rail={Rail_val} Vos={Vos_val} Phimargin={Phimargin_val} En={En_val} Enk={Enk_val} In={In_val} Ink={Ink_val} Rin={Rin_val} Ro={Ro_val} Ccm={Ccm_val} Cdiff={Cdiff_val} (symbol OpAmps\UniversalOpAmp4 not available, pins judged from their places): In+=out16 In-=N128 V+=VDD V-=VSS OUT=N104
* U64: UniversalOpAmp4 Avol={Avol_val} GBW={GBW_val} Slew={Slew_val} Ilimit={Ilimit_val} Rail={Rail_val} Vos={Vos_val} Phimargin={Phimargin_val} En={En_val} Enk={Enk_val} In={In_val} Ink={Ink_val} Rin={Rin_val} Ro={Ro_val} Ccm={Ccm_val} Cdiff={Cdiff_val} (symbol OpAmps\UniversalOpAmp4 not available, pins judged from their places): In+=N142 In-=N128 V+=VDD V-=VSS OUT=N103
C65 in17 N105 {GICC(C_val,65)}
R98 N105 N129 {R1_val}
R99 N129 N106 {R2_val}
R100 N106 N143 {R3_val}
C66 N143 0 {GICC(C_val,66)}
C67 out17 N107 {GICC(C_val,67)}
R101 N107 N130 {R4_val}
R102 N130 N108 {R5_val}
R103 N108 N144 {R6_val}
C68 N144 0 {GICC(C_val,68)}
Rn17 out17 in17 R=Rn(17,V(in17,out17))
* U65: UniversalOpAmp4 Avol={Avol_val} GBW={GBW_val} Slew={Slew_val} Ilimit={Ilimit_val} Rail={Rail_val} Vos={Vos_val} Phimargin={Phimargin_val} En={En_val} Enk={Enk_val} In={In_val} Ink={Ink_val} Rin={Rin_val} Ro={Ro_val} Ccm={Ccm_val} Cdiff={Cdiff_val} (symbol OpAmps\UniversalOpAmp4 not available, pins judged from their places): In+=in17 In-=N129 V+=VDD V-=VSS OUT=N106
* U66: UniversalOpAmp4 Avol={Avol_val} GBW={GBW_val} Slew={Slew_val} Ilimit={Ilimit_val} Rail={Rail_val} Vos={Vos_val} Phimargin={Phimargin_val} En={En_val} Enk={Enk_val} In={In_val} Ink={Ink_val} Rin={Rin_val} Ro={Ro_val} Ccm={Ccm_val} Cdiff={Cdiff_val} (symbol OpAmps\UniversalOpAmp4 not available, pins judged from their places): In+=N143 In-=N129 V+=VDD V-=VSS OUT=N105
* U67: UniversalOpAmp4 Avol={Avol_val} GBW={GBW_val} Slew={Slew_val} Ilimit={Ilimit_val} Rail={Rail_val} Vos={Vos_val} Phimargin={Phimargin_val} En={En_val} Enk={Enk_val} In={In_val} Ink={Ink_val} Rin={Rin_val} Ro={Ro_val} Ccm={Ccm_val} Cdiff={Cdiff_val} (symbol OpAmps\UniversalOpAmp4 not available, pins judged from their places): In+=out17 In-=N130 V+=VDD V-=VSS OUT=N108
* U68: UniversalOpAmp4 Avol={Avol_val} GBW={GBW_val} Slew={Slew_val} Ilimit={Ilimit_val} Rail={Rail_val} Vos={Vos_val} Phimargin={Phimargin_val} En={En_val} Enk={Enk_val} In={In_val} Ink={Ink_val} Rin={Rin_val} Ro={Ro_val} Ccm={Ccm_val} Cdiff={Cdiff_val} (symbol OpAmps\UniversalOpAmp4 not available, pins judged from their places): In+=N144 In-=N130 V+=VDD V-=VSS OUT=N107
C69 in18 N109 {GICC(C_val,69)}
R104 N109 N131 {R1_val}
R105 N131 N110 {R2_val}
R106 N110 N145 {R3_val}
C70 N145 0 {GICC(C_val,70)}
C71 out18 N111 {GICC(C_val,71)}
R107 N111 N132 {R4_val}
R108 N132 N112 {R5_val}
R109 N112 N146 {R6_val}
C72 N146 0 {GICC(C_val,72)}
Rn18 out18 in18 R=Rn(18,V(in18,out18))
* U69: UniversalOpAmp4 Avol={Avol_val} GBW={GBW_val} Slew={Slew_val} Ilimit={Ilimit_val} Rail={Rail_val} Vos={Vos_val} Phimargin={Phimargin_val} En={En_val} Enk={Enk_val} In={In_val} Ink={Ink_val} Rin={Rin_val} Ro={Ro_val} Ccm={Ccm_val} Cdiff={Cdiff_val} (symbol OpAmps\UniversalOpAmp4 not available, pins judged from their places): In+=in18 In-=N131 V+=VDD V-=VSS OUT=N110
* U70: UniversalOpAmp4 Avol={Avol_val} GBW={GBW_val} Slew={Slew_val} Ilimit={Ilimit_val} Rail={Rail_val} Vos={Vos_val} Phimargin={Phimargin_val} En={En_val} Enk={Enk_val} In={In_val} Ink={Ink_val} Rin={Rin_val} Ro={Ro_val} Ccm={Ccm_val} Cdiff={Cdiff_val} (symbol OpAmps\UniversalOpAmp4 not available, pins judged from their places): In+=N145 In-=N131 V+=VDD V-=VSS OUT=N109
* U71: UniversalOpAmp4 Avol={Avol_val} GBW={GBW_val} Slew={Slew_val} Ilimit={Ilimit_val} Rail={Rail_val} Vos={Vos_val} Phimargin={Phimargin_val} En={En_val} Enk={Enk_val} In={In_val} Ink={Ink_val} Rin={Rin_val} Ro={Ro_val} Ccm={Ccm_val} Cdiff={Cdiff_val} (symbol OpAmps\UniversalOpAmp4 not available, pins judged from their places): In+=out18 In-=N132 V+=VDD V-=VSS OUT=N112
* U72: UniversalOpAmp4 Avol={Avol_val} GBW={GBW_val} Slew={Slew_val} Ilimit={Ilimit_val} Rail={Rail_val} Vos={Vos_val} Phimargin={Phimargin_val} En={En_val} Enk={Enk_val} In={In_val} Ink={Ink_val} Rin={Rin_val} Ro={Ro_val} Ccm={Ccm_val} Cdiff={Cdiff_val} (symbol OpAmps\UniversalOpAmp4 not available, pins judged from their places): In+=N146 In-=N132 V+=VDD V-=VSS OUT=N111
C73 in19 N113 {GICC(C_val,73)}
R110 N113 N133 {R1_val}
R111 N133 N114 {R2_val}
R112 N114 N147 {R3_val}
C74 N147 0 {GICC(C_val,74)}
C75 out19 N115 {GICC(C_val,75)}
R113 N115 N134 {R4_val}
R114 N134 N116 {R5_val}
R115 N116 N148 {R6_val}
C76 N148 0 {GICC(C_val,76)}
Rn19 out19 in19 R=Rn(19,V(in19,out19))
* U73: UniversalOpAmp4 Avol={Avol_val} GBW={GBW_val} Slew={Slew_val} Ilimit={Ilimit_val} Rail={Rail_val} Vos={Vos_val} Phimargin={Phimargin_val} En={En_val} Enk={Enk_val} In={In_val} Ink={Ink_val} Rin={Rin_val} Ro={Ro_val} Ccm={Ccm_val} Cdiff={Cdiff_val} (symbol OpAmps\UniversalOpAmp4 not available, pins judged from their places): In+=in19 In-=N133 V+=VDD V-=VSS OUT=N114
* U74: UniversalOpAmp4 Avol={Avol_val} GBW={GBW_val} Slew={Slew_val} Ilimit={Ilimit_val} Rail={Rail_val} Vos={Vos_val} Phimargin={Phimargin_val} En={En_val} Enk={Enk_val} In={In_val} Ink={Ink_val} Rin={Rin_val} Ro={Ro_val} Ccm={Ccm_val} Cdiff={Cdiff_val} (symbol OpAmps\UniversalOpAmp4 not available, pins judged from their places): In+=N147 In-=N133 V+=VDD V-=VSS OUT=N113
* U75: UniversalOpAmp4 Avol={Avol_val} GBW={GBW_val} Slew={Slew_val} Ilimit={Ilimit_val} Rail={Rail_val} Vos={Vos_val} Phimargin={Phimargin_val} En={En_val} Enk={Enk_val} In={In_val} Ink={Ink_val} Rin={Rin_val} Ro={Ro_val} Ccm={Ccm_val} Cdiff={Cdiff_val} (symbol OpAmps\UniversalOpAmp4 not available, pins judged from their places): In+=out19 In-=N134 V+=VDD V-=VSS OUT=N116
* U76: UniversalOpAmp4 Avol={Avol_val} GBW={GBW_val} Slew={Slew_val} Ilimit={Ilimit_val} Rail={Rail_val} Vos={Vos_val} Phimargin={Phimargin_val} En={En_val} Enk={Enk_val} In={In_val} Ink={Ink_val} Rin={Rin_val} Ro={Ro_val} Ccm={Ccm_val} Cdiff={Cdiff_val} (symbol OpAmps\UniversalOpAmp4 not available, pins judged from their places): In+=N148 In-=N134 V+=VDD V-=VSS OUT=N115
C77 in20 N117 {GICC(C_val,77)}
R116 N117 N135 {R1_val}
R117 N135 N118 {R2_val}
R118 N118 N149 {R3_val}
C78 N149 0 {GICC(C_val,78)}
C79 out20 N119 {GICC(C_val,79)}
R119 N119 N136 {R4_val}
R120 N136 N120 {R5_val}
R121 N120 N150 {R6_val}
C80 N150 0 {GICC(C_val,80)}
Rn20 out20 in20 R=Rn(20,V(in20,out20))
* U77: UniversalOpAmp4 Avol={Avol_val} GBW={GBW_val} Slew={Slew_val} Ilimit={Ilimit_val} Rail={Rail_val} Vos={Vos_val} Phimargin={Phimargin_val} En={En_val} Enk={Enk_val} In={In_val} Ink={Ink_val} Rin={Rin_val} Ro={Ro_val} Ccm={Ccm_val} Cdiff={Cdiff_val} (symbol OpAmps\UniversalOpAmp4 not available, pins judged from their places): In+=in20 In-=N135 V+=VDD V-=VSS OUT=N118
* U78: UniversalOpAmp4 Avol={Avol_val} GBW={GBW_val} Slew={Slew_val} Ilimit={Ilimit_val} Rail={Rail_val} Vos={Vos_val} Phimargin={Phimargin_val} En={En_val} Enk={Enk_val} In={In_val} Ink={Ink_val} Rin={Rin_val} Ro={Ro_val} Ccm={Ccm_val} Cdiff={Cdiff_val} (symbol OpAmps\UniversalOpAmp4 not available, pins judged from their places): In+=N149 In-=N135 V+=VDD V-=VSS OUT=N117
* U79: UniversalOpAmp4 Avol={Avol_val} GBW={GBW_val} Slew={Slew_val} Ilimit={Ilimit_val} Rail={Rail_val} Vos={Vos_val} Phimargin={Phimargin_val} En={En_val} Enk={Enk_val} In={In_val} Ink={Ink_val} Rin={Rin_val} Ro={Ro_val} Ccm={Ccm_val} Cdiff={Cdiff_val} (symbol OpAmps\UniversalOpAmp4 not available, pins judged from their places): In+=out20 In-=N136 V+=VDD V-=VSS OUT=N120
* U80: UniversalOpAmp4 Avol={Avol_val} GBW={GBW_val} Slew={Slew_val} Ilimit={Ilimit_val} Rail={Rail_val} Vos={Vos_val} Phimargin={Phimargin_val} En={En_val} Enk={Enk_val} In={In_val} Ink={Ink_val} Rin={Rin_val} Ro={Ro_val} Ccm={Ccm_val} Cdiff={Cdiff_val} (symbol OpAmps\UniversalOpAmp4 not available, pins judged from their places): In+=N150 In-=N136 V+=VDD V-=VSS OUT=N119
C81 in21 N121 {GICC(C_val,81)}
R122 N121 N137 {R1_val}
R123 N137 N122 {R2_val}
R124 N122 N151 {R3_val}
C82 N151 0 {GICC(C_val,82)}
C83 out21 N123 {GICC(C_val,83)}
R125 N123 N138 {R4_val}
R126 N138 N124 {R5_val}
R127 N124 N152 {R6_val}
C84 N152 0 {GICC(C_val,84)}
Rn21 out21 in21 R=Rn(21,V(in21,out21))
* U81: UniversalOpAmp4 Avol={Avol_val} GBW={GBW_val} Slew={Slew_val} Ilimit={Ilimit_val} Rail={Rail_val} Vos={Vos_val} Phimargin={Phimargin_val} En={En_val} Enk={Enk_val} In={In_val} Ink={Ink_val} Rin={Rin_val} Ro={Ro_val} Ccm={Ccm_val} Cdiff={Cdiff_val} (symbol OpAmps\UniversalOpAmp4 not available, pins judged from their places): In+=in21 In-=N137 V+=VDD V-=VSS OUT=N122
* U82: UniversalOpAmp4 Avol={Avol_val} GBW={GBW_val} Slew={Slew_val} Ilimit={Ilimit_val} Rail={Rail_val} Vos={Vos_val} Phimargin={Phimargin_val} En={En_val} Enk={Enk_val} In={In_val} Ink={Ink_val} Rin={Rin_val} Ro={Ro_val} Ccm={Ccm_val} Cdiff={Cdiff_val} (symbol OpAmps\UniversalOpAmp4 not available, pins judged from their places): In+=N151 In-=N137 V+=VDD V-=VSS OUT=N121
* U83: UniversalOpAmp4 Avol={Avol_val} GBW={GBW_val} Slew={Slew_val} Ilimit={Ilimit_val} Rail={Rail_val} Vos={Vos_val} Phimargin={Phimargin_val} En={En_val} Enk={Enk_val} In={In_val} Ink={Ink_val} Rin={Rin_val} Ro={Ro_val} Ccm={Ccm_val} Cdiff={Cdiff_val} (symbol OpAmps\UniversalOpAmp4 not available, pins judged from their places): In+=out21 In-=N138 V+=VDD V-=VSS OUT=N124
* U84: UniversalOpAmp4 Avol={Avol_val} GBW={GBW_val} Slew={Slew_val} Ilimit={Ilimit_val} Rail={Rail_val} Vos={Vos_val} Phimargin={Phimargin_val} En={En_val} Enk={Enk_val} In={In_val} Ink={Ink_val} Rin={Rin_val} Ro={Ro_val} Ccm={Ccm_val} Cdiff={Cdiff_val} (symbol OpAmps\UniversalOpAmp4 not available, pins judged from their places): In+=N152 In-=N138 V+=VDD V-=VSS OUT=N123
C85 in22 N153 {GICC(C_val,85)}
R128 N153 N181 {R1_val}
R129 N181 N154 {R2_val}
R130 N154 N195 {R3_val}
C86 N195 0 {GICC(C_val,86)}
C87 out22 N155 {GICC(C_val,87)}
R131 N155 N182 {R4_val}
R132 N182 N156 {R5_val}
R133 N156 N196 {R6_val}
C88 N196 0 {GICC(C_val,88)}
Rn22 out22 in22 R=Rn(22,V(in22,out22))
* U85: UniversalOpAmp4 Avol={Avol_val} GBW={GBW_val} Slew={Slew_val} Ilimit={Ilimit_val} Rail={Rail_val} Vos={Vos_val} Phimargin={Phimargin_val} En={En_val} Enk={Enk_val} In={In_val} Ink={Ink_val} Rin={Rin_val} Ro={Ro_val} Ccm={Ccm_val} Cdiff={Cdiff_val} (symbol OpAmps\UniversalOpAmp4 not available, pins judged from their places): In+=in22 In-=N181 V+=VDD V-=VSS OUT=N154
* U86: UniversalOpAmp4 Avol={Avol_val} GBW={GBW_val} Slew={Slew_val} Ilimit={Ilimit_val} Rail={Rail_val} Vos={Vos_val} Phimargin={Phimargin_val} En={En_val} Enk={Enk_val} In={In_val} Ink={Ink_val} Rin={Rin_val} Ro={Ro_val} Ccm={Ccm_val} Cdiff={Cdiff_val} (symbol OpAmps\UniversalOpAmp4 not available, pins judged from their places): In+=N195 In-=N181 V+=VDD V-=VSS OUT=N153
* U87: UniversalOpAmp4 Avol={Avol_val} GBW={GBW_val} Slew={Slew_val} Ilimit={Ilimit_val} Rail={Rail_val} Vos={Vos_val} Phimargin={Phimargin_val} En={En_val} Enk={Enk_val} In={In_val} Ink={Ink_val} Rin={Rin_val} Ro={Ro_val} Ccm={Ccm_val} Cdiff={Cdiff_val} (symbol OpAmps\UniversalOpAmp4 not available, pins judged from their places): In+=out22 In-=N182 V+=VDD V-=VSS OUT=N156
* U88: UniversalOpAmp4 Avol={Avol_val} GBW={GBW_val} Slew={Slew_val} Ilimit={Ilimit_val} Rail={Rail_val} Vos={Vos_val} Phimargin={Phimargin_val} En={En_val} Enk={Enk_val} In={In_val} Ink={Ink_val} Rin={Rin_val} Ro={Ro_val} Ccm={Ccm_val} Cdiff={Cdiff_val} (symbol OpAmps\UniversalOpAmp4 not available, pins judged from their places): In+=N196 In-=N182 V+=VDD V-=VSS OUT=N155
C89 in23 N157 {GICC(C_val,89)}
R134 N157 N183 {R1_val}
R135 N183 N158 {R2_val}
R136 N158 N197 {R3_val}
C90 N197 0 {GICC(C_val,90)}
C91 out23 N159 {GICC(C_val,91)}
R137 N159 N184 {R4_val}
R138 N184 N160 {R5_val}
R139 N160 N198 {R6_val}
C92 N198 0 {GICC(C_val,92)}
Rn23 out23 in23 R=Rn(23,V(in23,out23))
* U89: UniversalOpAmp4 Avol={Avol_val} GBW={GBW_val} Slew={Slew_val} Ilimit={Ilimit_val} Rail={Rail_val} Vos={Vos_val} Phimargin={Phimargin_val} En={En_val} Enk={Enk_val} In={In_val} Ink={Ink_val} Rin={Rin_val} Ro={Ro_val} Ccm={Ccm_val} Cdiff={Cdiff_val} (symbol OpAmps\UniversalOpAmp4 not available, pins judged from their places): In+=in23 In-=N183 V+=VDD V-=VSS OUT=N158
* U90: UniversalOpAmp4 Avol={Avol_val} GBW={GBW_val} Slew={Slew_val} Ilimit={Ilimit_val} Rail={Rail_val} Vos={Vos_val} Phimargin={Phimargin_val} En={En_val} Enk={Enk_val} In={In_val} Ink={Ink_val} Rin={Rin_val} Ro={Ro_val} Ccm={Ccm_val} Cdiff={Cdiff_val} (symbol OpAmps\UniversalOpAmp4 not available, pins judged from their places): In+=N197 In-=N183 V+=VDD V-=VSS OUT=N157
* U91: UniversalOpAmp4 Avol={Avol_val} GBW={GBW_val} Slew={Slew_val} Ilimit={Ilimit_val} Rail={Rail_val} Vos={Vos_val} Phimargin={Phimargin_val} En={En_val} Enk={Enk_val} In={In_val} Ink={Ink_val} Rin={Rin_val} Ro={Ro_val} Ccm={Ccm_val} Cdiff={Cdiff_val} (symbol OpAmps\UniversalOpAmp4 not available, pins judged from their places): In+=out23 In-=N184 V+=VDD V-=VSS OUT=N160
* U92: UniversalOpAmp4 Avol={Avol_val} GBW={GBW_val} Slew={Slew_val} Ilimit={Ilimit_val} Rail={Rail_val} Vos={Vos_val} Phimargin={Phimargin_val} En={En_val} Enk={Enk_val} In={In_val} Ink={Ink_val} Rin={Rin_val} Ro={Ro_val} Ccm={Ccm_val} Cdiff={Cdiff_val} (symbol OpAmps\UniversalOpAmp4 not available, pins judged from their places): In+=N198 In-=N184 V+=VDD V-=VSS OUT=N159
C93 in24 N161 {GICC(C_val,93)}
R140 N161 N185 {R1_val}
R141 N185 N162 {R2_val}
R142 N162 N199 {R3_val}
C94 N199 0 {GICC(C_val,94)}
C95 out24 N163 {GICC(C_val,95)}
R143 N163 N186 {R4_val}
R144 N186 N164 {R5_val}
R145 N164 N200 {R6_val}
C96 N200 0 {GICC(C_val,96)}
Rn24 out24 in24 R=Rn(24,V(in24,out24))
* U93: UniversalOpAmp4 Avol={Avol_val} GBW={GBW_val} Slew={Slew_val} Ilimit={Ilimit_val} Rail={Rail_val} Vos={Vos_val} Phimargin={Phimargin_val} En={En_val} Enk={Enk_val} In={In_val} Ink={Ink_val} Rin={Rin_val} Ro={Ro_val} Ccm={Ccm_val} Cdiff={Cdiff_val} (symbol OpAmps\UniversalOpAmp4 not available, pins judged from their places): In+=in24 In-=N185 V+=VDD V-=VSS OUT=N162
* U94: UniversalOpAmp4 Avol={Avol_val} GBW={GBW_val} Slew={Slew_val} Ilimit={Ilimit_val} Rail={Rail_val} Vos={Vos_val} Phimargin={Phimargin_val} En={En_val} Enk={Enk_val} In={In_val} Ink={Ink_val} Rin={Rin_val} Ro={Ro_val} Ccm={Ccm_val} Cdiff={Cdiff_val} (symbol OpAmps\UniversalOpAmp4 not available, pins judged from their places): In+=N199 In-=N185 V+=VDD V-=VSS OUT=N161
* U95: UniversalOpAmp4 Avol={Avol_val} GBW={GBW_val} Slew={Slew_val} Ilimit={Ilimit_val} Rail={Rail_val} Vos={Vos_val} Phimargin={Phimargin_val} En={En_val} Enk={Enk_val} In={In_val} Ink={Ink_val} Rin={Rin_val} Ro={Ro_val} Ccm={Ccm_val} Cdiff={Cdiff_val} (symbol OpAmps\UniversalOpAmp4 not available, pins judged from their places): In+=out24 In-=N186 V+=VDD V-=VSS OUT=N164
* U96: UniversalOpAmp4 Avol={Avol_val} GBW={GBW_val} Slew={Slew_val} Ilimit={Ilimit_val} Rail={Rail_val} Vos={Vos_val} Phimargin={Phimargin_val} En={En_val} Enk={Enk_val} In={In_val} Ink={Ink_val} Rin={Rin_val} Ro={Ro_val} Ccm={Ccm_val} Cdiff={Cdiff_val} (symbol OpAmps\UniversalOpAmp4 not available, pins judged from their places): In+=N200 In-=N186 V+=VDD V-=VSS OUT=N163
C97 in25 N165 {GICC(C_val,97)}
R146 N165 N187 {R1_val}
R147 N187 N166 {R2_val}
R148 N166 N201 {R3_val}
C98 N201 0 {GICC(C_val,98)}
C99 out25 N167 {GICC(C_val,99)}
R149 N167 N188 {R4_val}
R150 N188 N168 {R5_val}
R151 N168 N202 {R6_val}
C100 N202 0 {GICC(C_val,100)}
Rn25 out25 in25 R=Rn(25,V(in25,out25))
* U97: UniversalOpAmp4 Avol={Avol_val} GBW={GBW_val} Slew={Slew_val} Ilimit={Ilimit_val} Rail={Rail_val} Vos={Vos_val} Phimargin={Phimargin_val} En={En_val} Enk={Enk_val} In={In_val} Ink={Ink_val} Rin={Rin_val} Ro={Ro_val} Ccm={Ccm_val} Cdiff={Cdiff_val} (symbol OpAmps\UniversalOpAmp4 not available, pins judged from their places): In+=in25 In-=N187 V+=VDD V-=VSS OUT=N166
* U98: UniversalOpAmp4 Avol={Avol_val} GBW={GBW_val} Slew={Slew_val} Ilimit={Ilimit_val} Rail={Rail_val} Vos={Vos_val} Phimargin={Phimargin_val} En={En_val} Enk={Enk_val} In={In_val} Ink={Ink_val} Rin={Rin_val} Ro={Ro_val} Ccm={Ccm_val} Cdiff={Cdiff_val} (symbol OpAmps\UniversalOpAmp4 not available, pins judged from their places): In+=N201 In-=N187 V+=VDD V-=VSS OUT=N165
* U99: UniversalOpAmp4 Avol={Avol_val} GBW={GBW_val} Slew={Slew_val} Ilimit={Ilimit_val} Rail={Rail_val} Vos={Vos_val} Phimargin={Phimargin_val} En={En_val} Enk={Enk_val} In={In_val} Ink={Ink_val} Rin={Rin_val} Ro={Ro_val} Ccm={Ccm_val} Cdiff={Cdiff_val} (symbol OpAmps\UniversalOpAmp4 not available, pins judged from their places): In+=out25 In-=N188 V+=VDD V-=VSS OUT=N168
* U100: UniversalOpAmp4 Avol={Avol_val} GBW={GBW_val} Slew={Slew_val} Ilimit={Ilimit_val} Rail={Rail_val} Vos={Vos_val} Phimargin={Phimargin_val} En={En_val} Enk={Enk_val} In={In_val} Ink={Ink_val} Rin={Rin_val} Ro={Ro_val} Ccm={Ccm_val} Cdiff={Cdiff_val} (symbol OpAmps\UniversalOpAmp4 not available, pins judged from their places): In+=N202 In-=N188 V+=VDD V-=VSS OUT=N167
C101 in26 N169 {GICC(C_val,101)}
R152 N169 N189 {R1_val}
R153 N189 N170 {R2_val}
R154 N170 N203 {R3_val}
C102 N203 0 {GICC(C_val,102)}
C103 out26 N171 {GICC(C_val,103)}
R155 N171 N190 {R4_val}
R156 N190 N172 {R5_val}
R157 N172 N204 {R6_val}
C104 N204 0 {GICC(C_val,104)}
Rn26 out26 in26 R=Rn(26,V(in26,out26))
* U101: UniversalOpAmp4 Avol={Avol_val} GBW={GBW_val} Slew={Slew_val} Ilimit={Ilimit_val} Rail={Rail_val} Vos={Vos_val} Phimargin={Phimargin_val} En={En_val} Enk={Enk_val} In={In_val} Ink={Ink_val} Rin={Rin_val} Ro={Ro_val} Ccm={Ccm_val} Cdiff={Cdiff_val} (symbol OpAmps\UniversalOpAmp4 not available, pins judged from their places): In+=in26 In-=N189 V+=VDD V-=VSS OUT=N170
* U102: UniversalOpAmp4 Avol={Avol_val} GBW={GBW_val} Slew={Slew_val} Ilimit={Ilimit_val} Rail={Rail_val} Vos={Vos_val} Phimargin={Phimargin_val} En={En_val} Enk={Enk_val} In={In_val} Ink={Ink_val} Rin={Rin_val} Ro={Ro_val} Ccm={Ccm_val} Cdiff={Cdiff_val} (symbol OpAmps\UniversalOpAmp4 not available, pins judged from their places): In+=N203 In-=N189 V+=VDD V-=VSS OUT=N169
* U103: UniversalOpAmp4 Avol={Avol_val} GBW={GBW_val} Slew={Slew_val} Ilimit={Ilimit_val} Rail={Rail_val} Vos={Vos_val} Phimargin={Phimargin_val} En={En_val} Enk={Enk_val} In={In_val} Ink={Ink_val} Rin={Rin_val} Ro={Ro_val} Ccm={Ccm_val} Cdiff={Cdiff_val} (symbol OpAmps\UniversalOpAmp4 not available, pins judged from their places): In+=out26 In-=N190 V+=VDD V-=VSS OUT=N172
* U104: UniversalOpAmp4 Avol={Avol_val} GBW={GBW_val} Slew={Slew_val} Ilimit={Ilimit_val} Rail={Rail_val} Vos={Vos_val} Phimargin={Phimargin_val} En={En_val} Enk={Enk_val} In={In_val} Ink={Ink_val} Rin={Rin_val} Ro={Ro_val} Ccm={Ccm_val} Cdiff={Cdiff_val} (symbol OpAmps\UniversalOpAmp4 not available, pins judged from their places): In+=N204 In-=N190 V+=VDD V-=VSS OUT=N171
C105 in27 N173 {GICC(C_val,105)}
R158 N173 N191 {R1_val}
R159 N191 N174 {R2_val}
R160 N174 N205 {R3_val}
C106 N205 0 {GICC(C_val,106)}
C107 out27 N175 {GICC(C_val,107)}
R161 N175 N192 {R4_val}
R162 N192 N176 {R5_val}
R163 N176 N206 {R6_val}
C108 N206 0 {GICC(C_val,108)}
Rn27 out27 in27 R=Rn(27,V(in27,out27))
* U105: UniversalOpAmp4 Avol={Avol_val} GBW={GBW_val} Slew={Slew_val} Ilimit={Ilimit_val} Rail={Rail_val} Vos={Vos_val} Phimargin={Phimargin_val} En={En_val} Enk={Enk_val} In={In_val} Ink={Ink_val} Rin={Rin_val} Ro={Ro_val} Ccm={Ccm_val} Cdiff={Cdiff_val} (symbol OpAmps\UniversalOpAmp4 not available, pins judged from their places): In+=in27 In-=N191 V+=VDD V-=VSS OUT=N174
* U106: UniversalOpAmp4 Avol={Avol_val} GBW={GBW_val} Slew={Slew_val} Ilimit={Ilimit_val} Rail={Rail_val} Vos={Vos_val} Phimargin={Phimargin_val} En={En_val} Enk={Enk_val} In={In_val} Ink={Ink_val} Rin={Rin_val} Ro={Ro_val} Ccm={Ccm_val} Cdiff={Cdiff_val} (symbol OpAmps\UniversalOpAmp4 not available, pins judged from their places): In+=N205 In-=N191 V+=VDD V-=VSS OUT=N173
* U107: UniversalOpAmp4 Avol={Avol_val} GBW={GBW_val} Slew={Slew_val} Ilimit={Ilimit_val} Rail={Rail_val} Vos={Vos_val} Phimargin={Phimargin_val} En={En_val} Enk={Enk_val} In={In_val} Ink={Ink_val} Rin={Rin_val} Ro={Ro_val} Ccm={Ccm_val} Cdiff={Cdiff_val} (symbol OpAmps\UniversalOpAmp4 not available, pins judged from their places): In+=out27 In-=N192 V+=VDD V-=VSS OUT=N176
* U108: UniversalOpAmp4 Avol={Avol_val} GBW={GBW_val} Slew={Slew_val} Ilimit={Ilimit_val} Rail={Rail_val} Vos={Vos_val} Phimargin={Phimargin_val} En={En_val} Enk={Enk_val} In={In_val} Ink={Ink_val} Rin={Rin_val} Ro={Ro_val} Ccm={Ccm_val} Cdiff={Cdiff_val} (symbol OpAmps\UniversalOpAmp4 not available, pins judged from their places): In+=N206 In-=N192 V+=VDD V-=VSS OUT=N175
C109 in28 N177 {GICC(C_val,109)}
R164 N177 N193 {R1_val}
R165 N193 N178 {R2_val}
R166 N178 N207 {R3_val}
C110 N207 0 {GICC(C_val,110)}
C111 out28 N179 {GICC(C_val,111)}
R167 N179 N194 {R4_val}
R168 N194 N180 {R5_val}
R169 N180 N208 {R6_val}
C112 N208 0 {GICC(C_val,112)}
Rn28 out28 in28 R=Rn(28,V(in28,out28))
* U109: UniversalOpAmp4 Avol={Avol_val} GBW={GBW_val} Slew={Slew_val} Ilimit={Ilimit_val} Rail={Rail_val} Vos={Vos_val} Phimargin={Phimargin_val} En={En_val} Enk={Enk_val} In={In_val} Ink={Ink_val} Rin={Rin_val} Ro={Ro_val} Ccm={Ccm_val} Cdiff={Cdiff_val} (symbol OpAmps\UniversalOpAmp4 not available, pins judged from their places): In+=in28 In-=N193 V+=VDD V-=VSS OUT=N178
* U110: UniversalOpAmp4 Avol={Avol_val} GBW={GBW_val} Slew={Slew_val} Ilimit={Ilimit_val} Rail={Rail_val} Vos={Vos_val} Phimargin={Phimargin_val} En={En_val} Enk={Enk_val} In={In_val} Ink={Ink_val} Rin={Rin_val} Ro={Ro_val} Ccm={Ccm_val} Cdiff={Cdiff_val} (symbol OpAmps\UniversalOpAmp4 not available, pins judged from their places): In+=N207 In-=N193 V+=VDD V-=VSS OUT=N177
* U111: UniversalOpAmp4 Avol={Avol_val} GBW={GBW_val} Slew={Slew_val} Ilimit={Ilimit_val} Rail={Rail_val} Vos={Vos_val} Phimargin={Phimargin_val} En={En_val} Enk={Enk_val} In={In_val} Ink={Ink_val} Rin={Rin_val} Ro={Ro_val} Ccm={Ccm_val} Cdiff={Cdiff_val} (symbol OpAmps\UniversalOpAmp4 not available, pins judged from their places): In+=out28 In-=N194 V+=VDD V-=VSS OUT=N180